# Altium project SOM.PrjPcb (part 1 of 2)
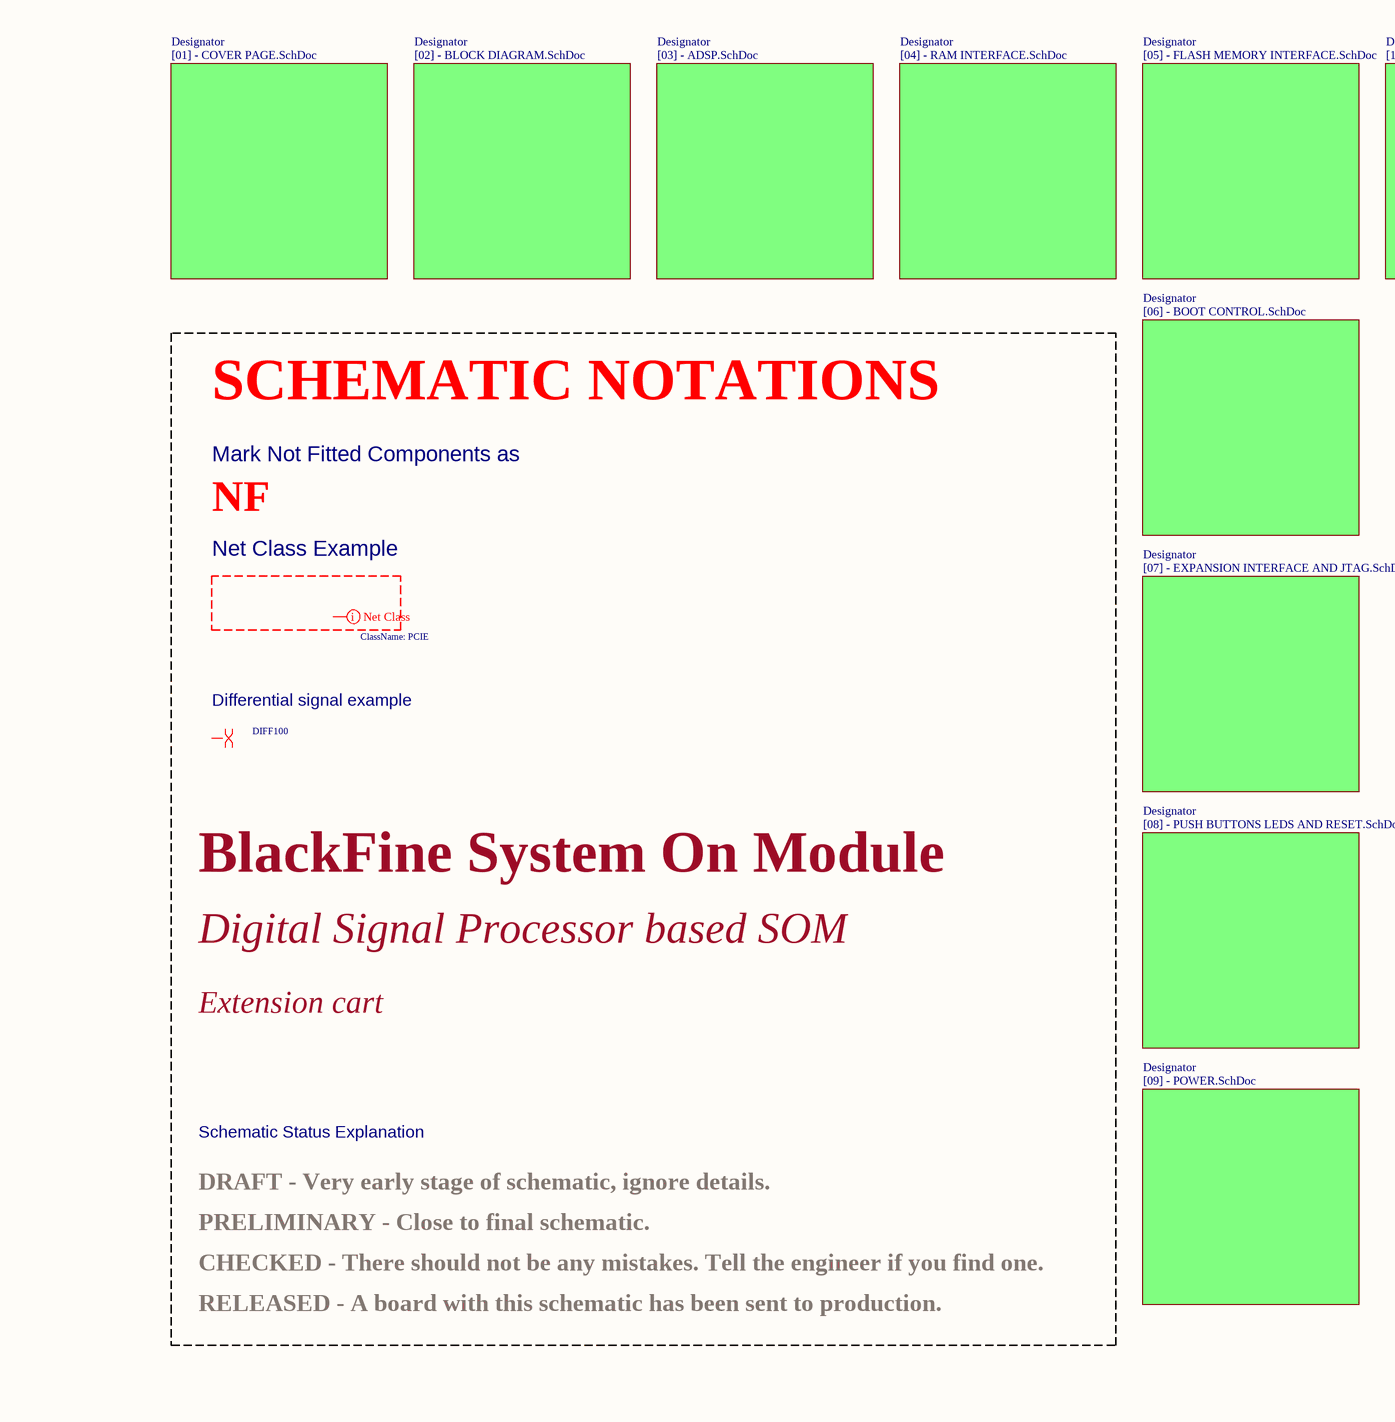
[diagram p0: SystemOnModule.SchDoc, left]
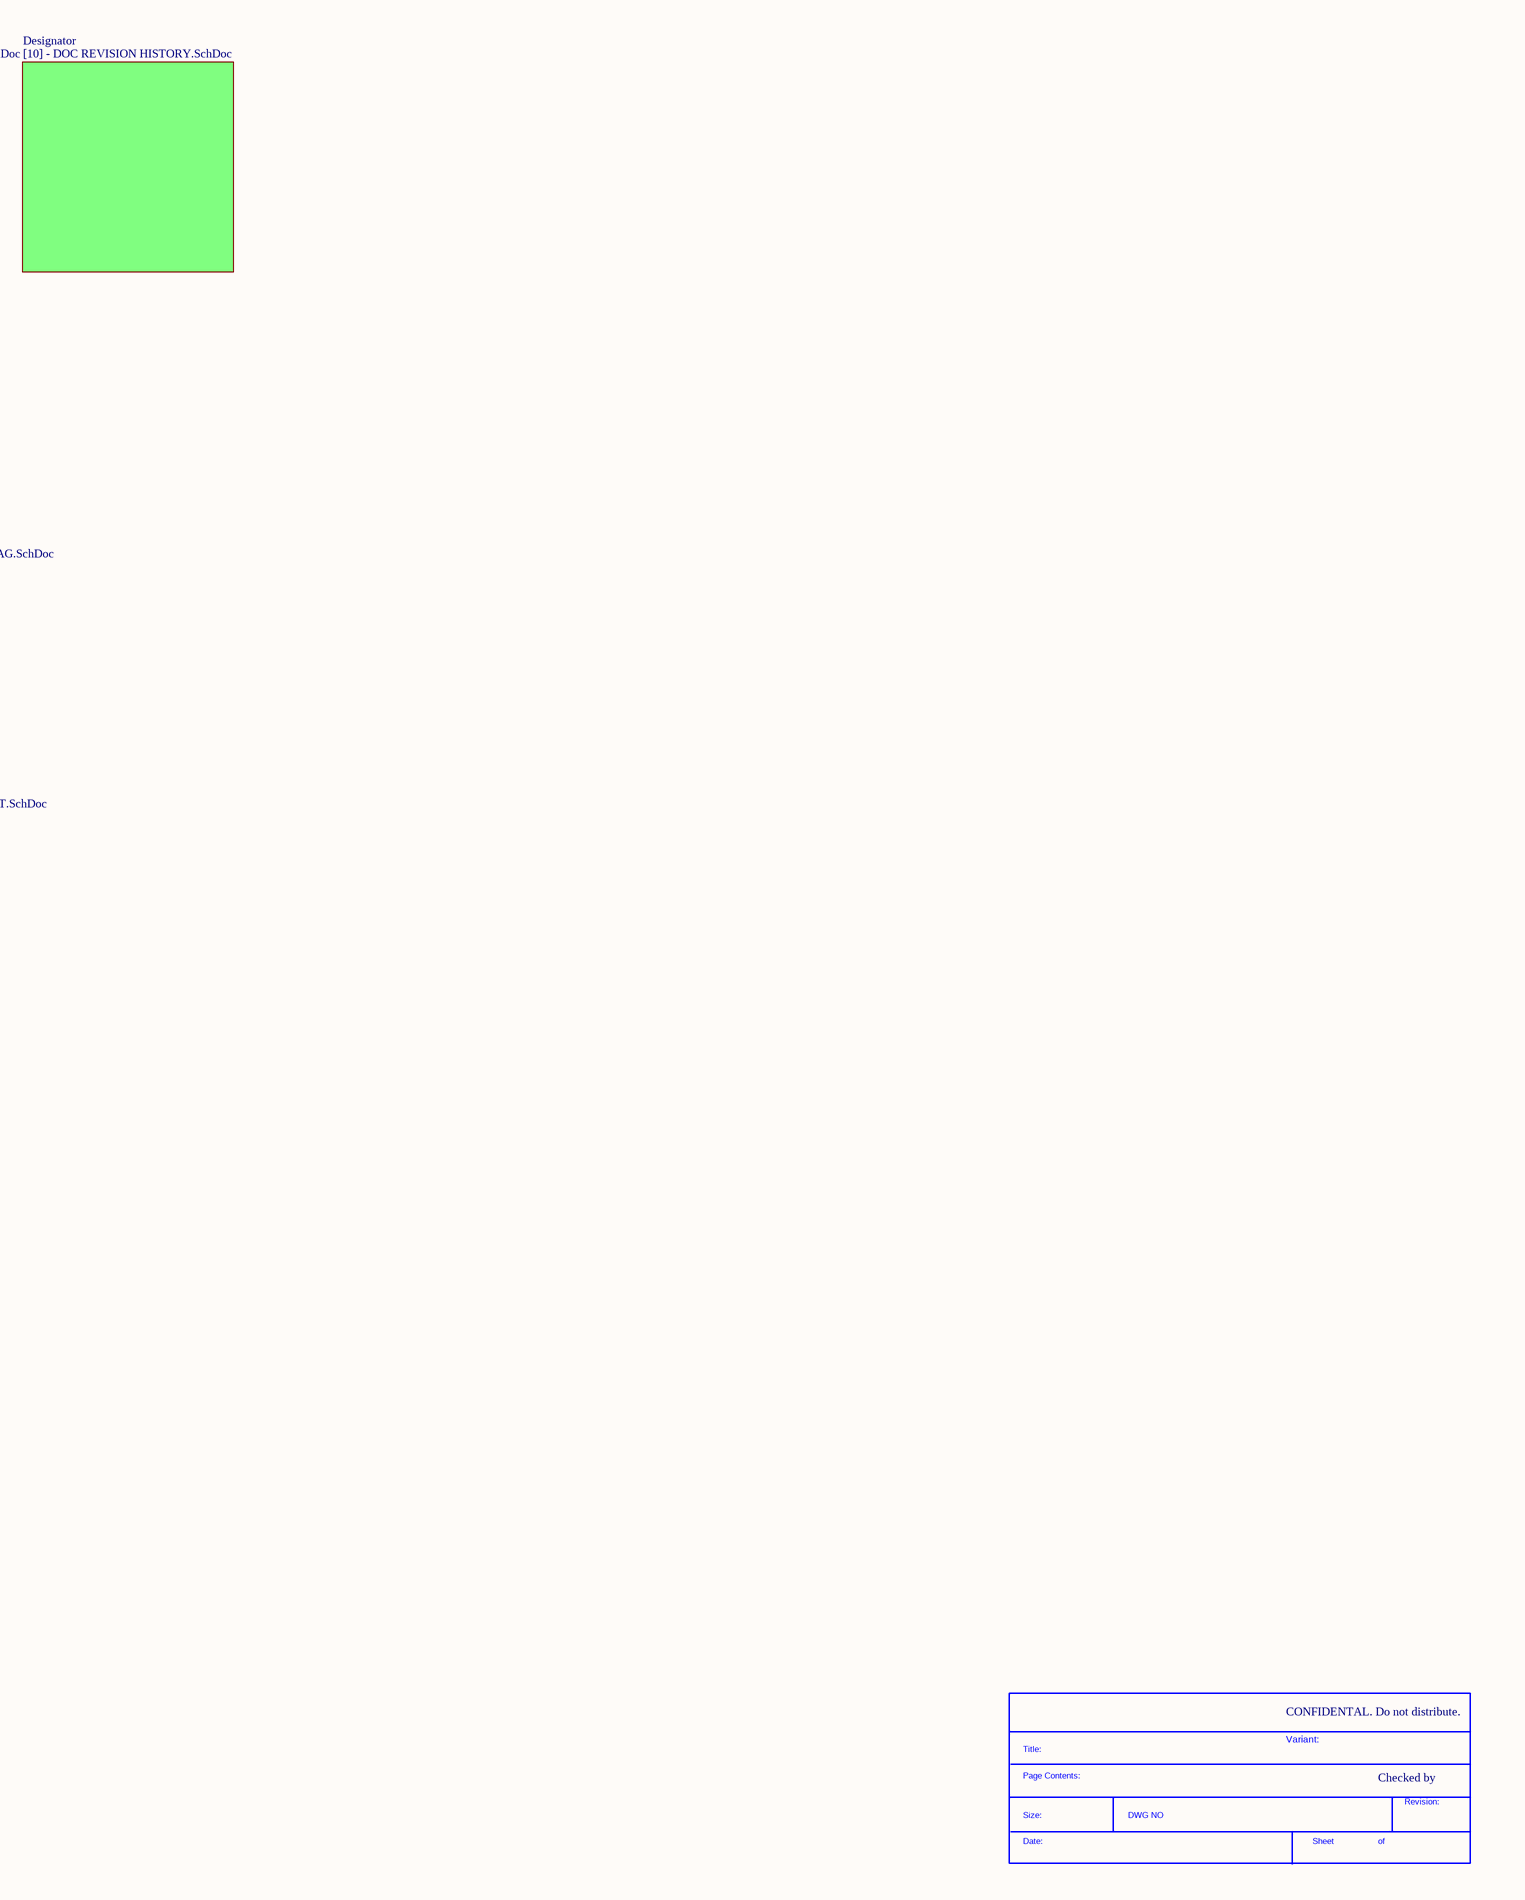
[diagram p1: SystemOnModule.SchDoc, right]
Company: Mars Robotics; Project: Blackfin DSP; SheetTotal: 10; VariantName: ORIGIN; VersionRevision: V1I1
11 sheets, 97 parts. Net scope: flat (ports and power ports of the same name join across sheets).
Board files: SOM_PCB.PcbDoc, SOM_PCB_6Layer.PcbDoc, SOM_PCB_BLUETECHNIX.PcbDoc
Sheets:
  SystemOnModule.SchDoc
    Designator = [01] - COVER PAGE.SchDoc
    Designator = [02] - BLOCK DIAGRAM.SchDoc
    Designator = [06] - BOOT CONTROL.SchDoc
    Designator = [03] - ADSP.SchDoc
    Designator = [04] - RAM INTERFACE.SchDoc
    Designator = [05] - FLASH MEMORY INTERFACE.SchDoc
    Designator = [07] - EXPANSION INTERFACE AND JTAG.SchDoc
    Designator = [08] - PUSH BUTTONS LEDS AND RESET.SchDoc
    Designator = [09] - POWER.SchDoc
    Designator = [10] - DOC REVISION HISTORY.SchDoc

## Sheet SystemOnModule.SchDoc
size A2; CompanyName: KDS; Organization: KDS; DocumentNumber: 4; Revision: V1I1; SheetNumber: 0; SheetTotal: 10; PageSetup: Record=PageOptions|CenterHorizontal=True|CenterVertical=True|PrintScale=1.07|XCorrection=1.00|YCorrection=1.00|PrintKind=1|BorderSize=5000000|LeftOffset=0|BottomOffset=0|Orientation=2|PaperLength=1000|PaperWidth=1000|Scale=100|PaperSource=7|PrintQuality=600|MediaType=1|DitherType=10|PaperKind=A3|PrintScaleMode=1; ProjectName: KDS C6A816x Module

### Parts
(Parts that share a designator on the sheet are numbered #1, #2 ... from top to bottom, then left to right.)
*#1  SDTitleBlock  (value not drawn)  (graphical)

### Sub-sheets
Designator = [01] - COVER PAGE.SchDoc: no entries
Designator = [02] - BLOCK DIAGRAM.SchDoc: no entries
Designator = [06] - BOOT CONTROL.SchDoc: no entries
Designator = [03] - ADSP.SchDoc: no entries
Designator = [04] - RAM INTERFACE.SchDoc: no entries
Designator = [05] - FLASH MEMORY INTERFACE.SchDoc: no entries
Designator = [07] - EXPANSION INTERFACE AND JTAG.SchDoc: no entries
Designator = [08] - PUSH BUTTONS LEDS AND RESET.SchDoc: no entries
Designator = [09] - POWER.SchDoc: no entries
Designator = [10] - DOC REVISION HISTORY.SchDoc: no entries

### Layout directives
net class PCIE: (no net found under the mark)
differential pair; net class DIFF100: (no net found under the mark)

### Notes on the sheet
- SCHEMATIC NOTATIONS
- Mark Not Fitted Components as
- NF
- Net Class Example
- Differential signal example
- BlackFine System On Module
- Digital Signal Processor based SOM
- Extension cart
- Schematic Status Explanation
- PRELIMINARY - Close to final schematic.
- DRAFT - Very early stage of schematic, ignore details.
- CHECKED - There should not be any mistakes. Tell the engineer if you find one.
- RELEASED - A board with this schematic has been sent to production.
- CONFIDENTAL. Do not distribute.
- Variant:
- Checked by
- (in symbol SDTitleBlock) Title:; Page Contents:; Revision:; Size:; DWG NO; Date:; Sheet; of

## Sheet [01] - COVER PAGE.SchDoc
size A2; DocumentNumber: 1; SheetNumber: 1; SheetTotal: 10; VariantName: ORIGIN
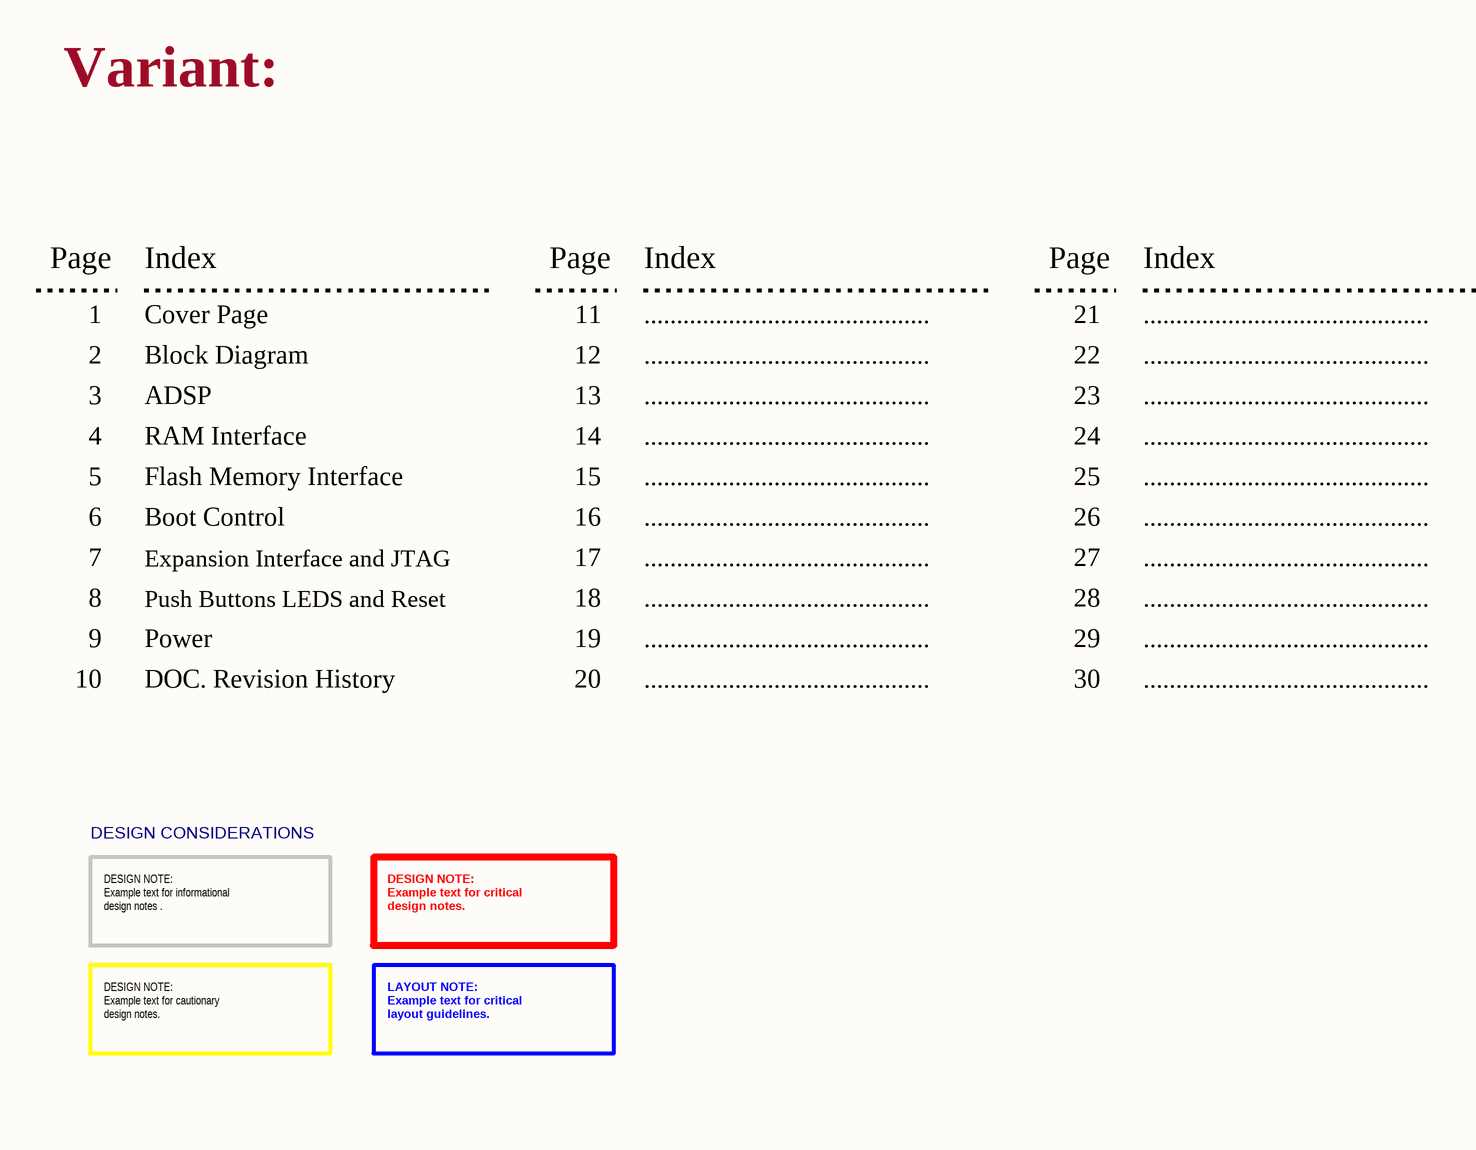
[diagram p2: [01] - COVER PAGE.SchDoc, left]
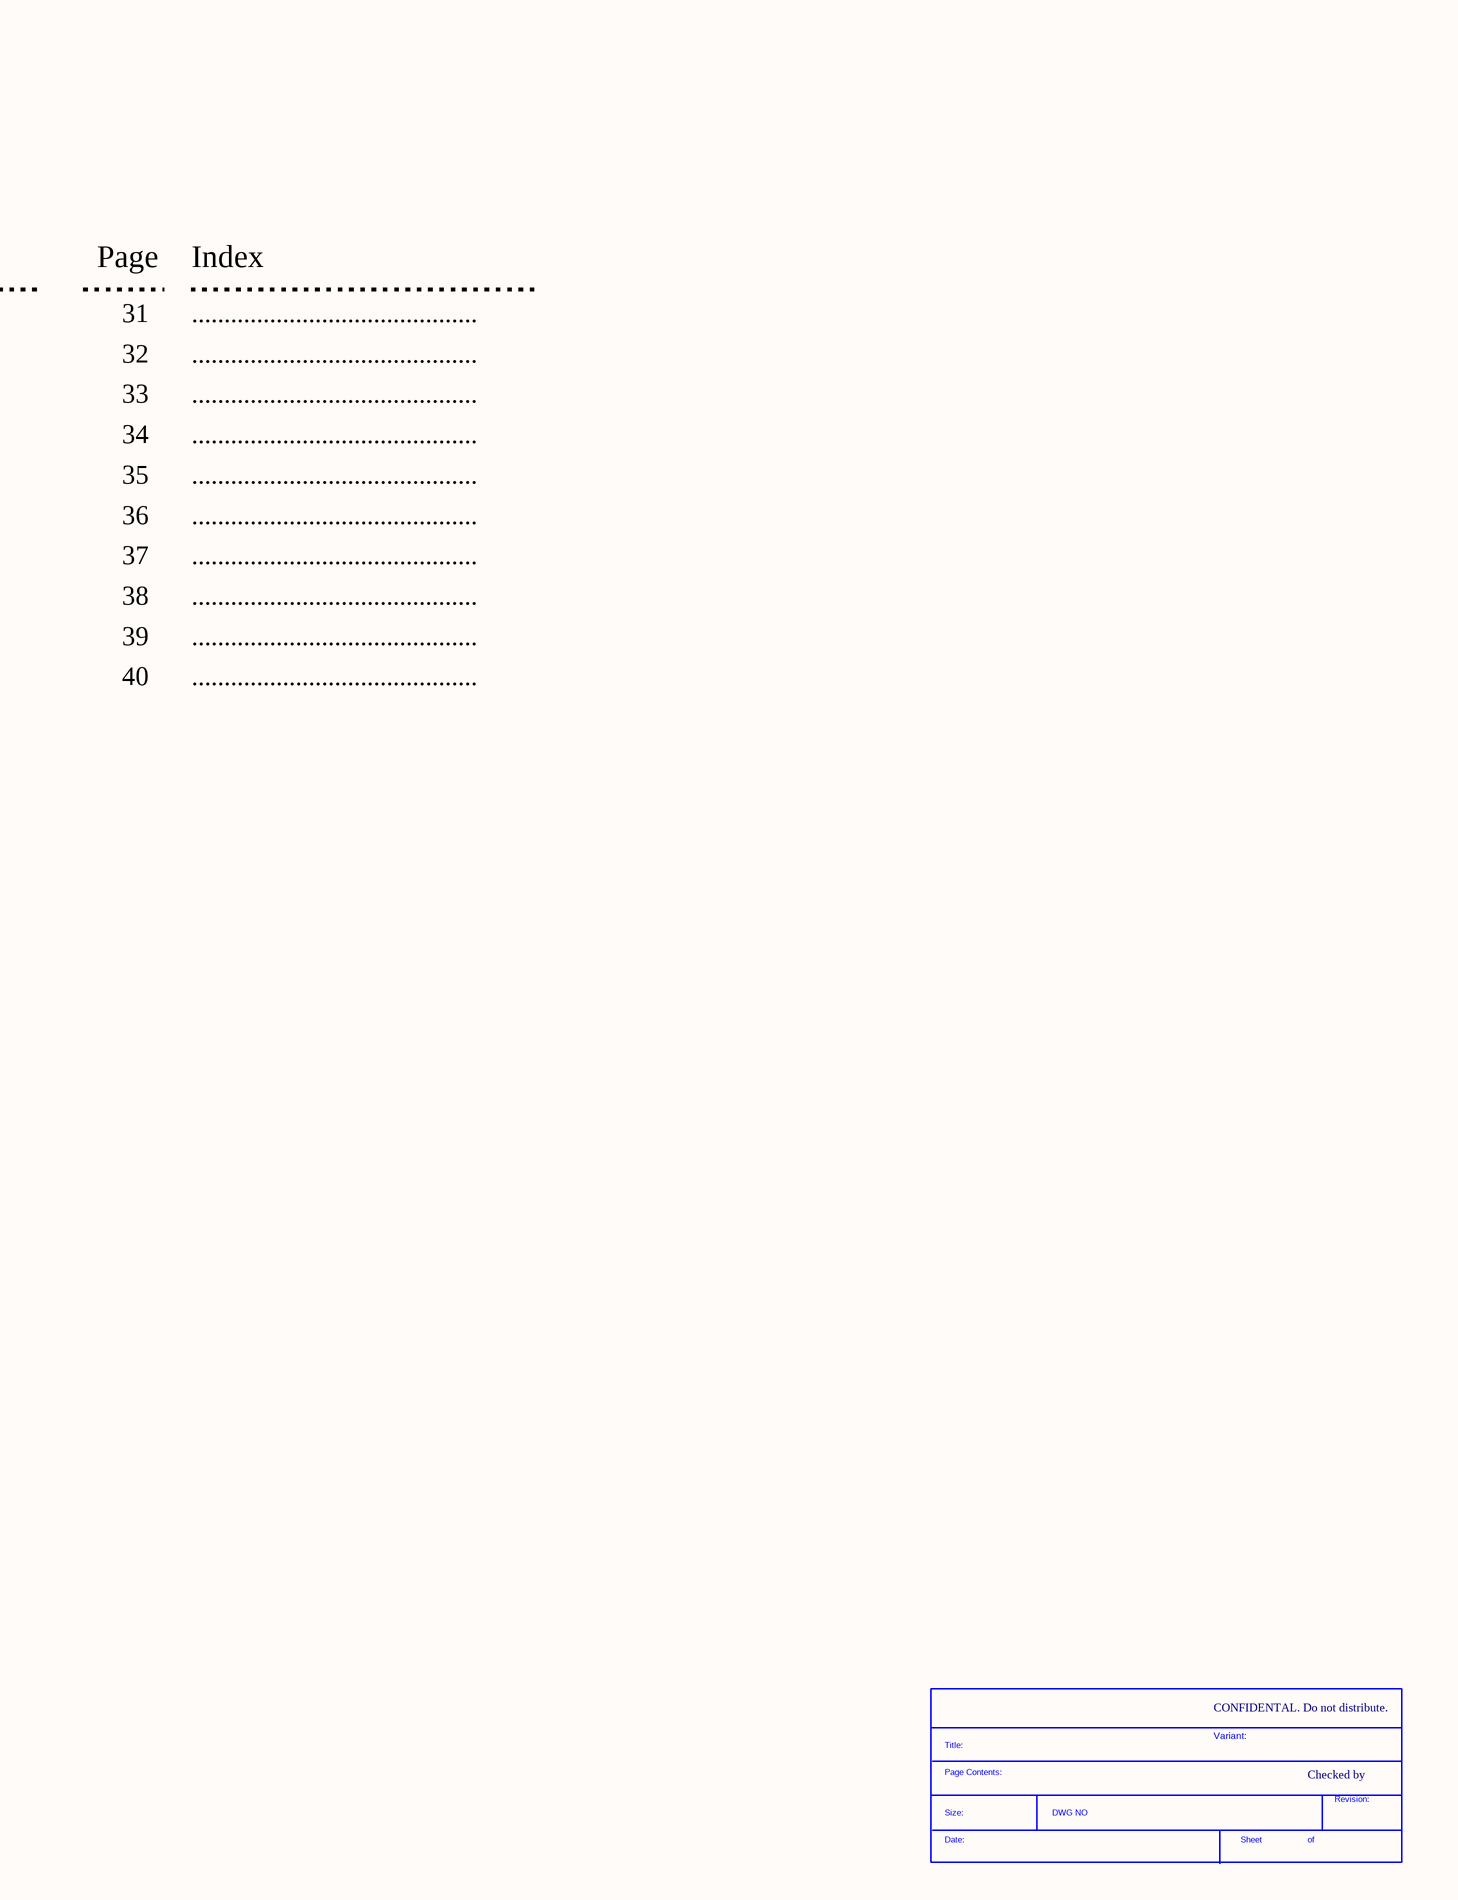
[diagram p3: [01] - COVER PAGE.SchDoc, right]

### Parts
(Parts that share a designator on the sheet are numbered #1, #2 ... from top to bottom, then left to right.)
*#2  SDTitleBlock  (value not drawn)  (graphical)

### Notes on the sheet
- Variant:
- Page
- Index
- 1
- 2
- Cover Page
- Block Diagram
- 11
- 12
- ............................................
- 21
- 22
- 31
- 32
- 3
- 4
- ADSP
- RAM Interface
- 13
- 14
- 23
- 24
- 33
- 34
- 5
- Flash Memory Interface
- 15
- 25
- 35
- 6
- 7
- Boot Control
- Expansion Interface and JTAG
- 16
- 17
- 26
- 27
- 36
- 37
- 8
- 9
- Push Buttons LEDS and Reset
- Power
- 18
- 19
- 28
- 29
- 38
- 39
- 10
- DOC. Revision History
- 20
- 30
- 40
- DESIGN CONSIDERATIONS
- DESIGN NOTE:
  Example text for informational
  design notes .
- DESIGN NOTE:
  Example text for critical
  design notes.
- DESIGN NOTE:
  Example text for cautionary
  design notes.
- LAYOUT NOTE:
  Example text for critical
  layout guidelines.
- CONFIDENTAL. Do not distribute.
- Checked by
- (in symbol SDTitleBlock) Title:; Page Contents:; Revision:; Size:; DWG NO; Date:; Sheet; of

## Sheet [02] - BLOCK DIAGRAM.SchDoc
size A2; DocumentNumber: 2; SheetNumber: 2; SheetTotal: 10
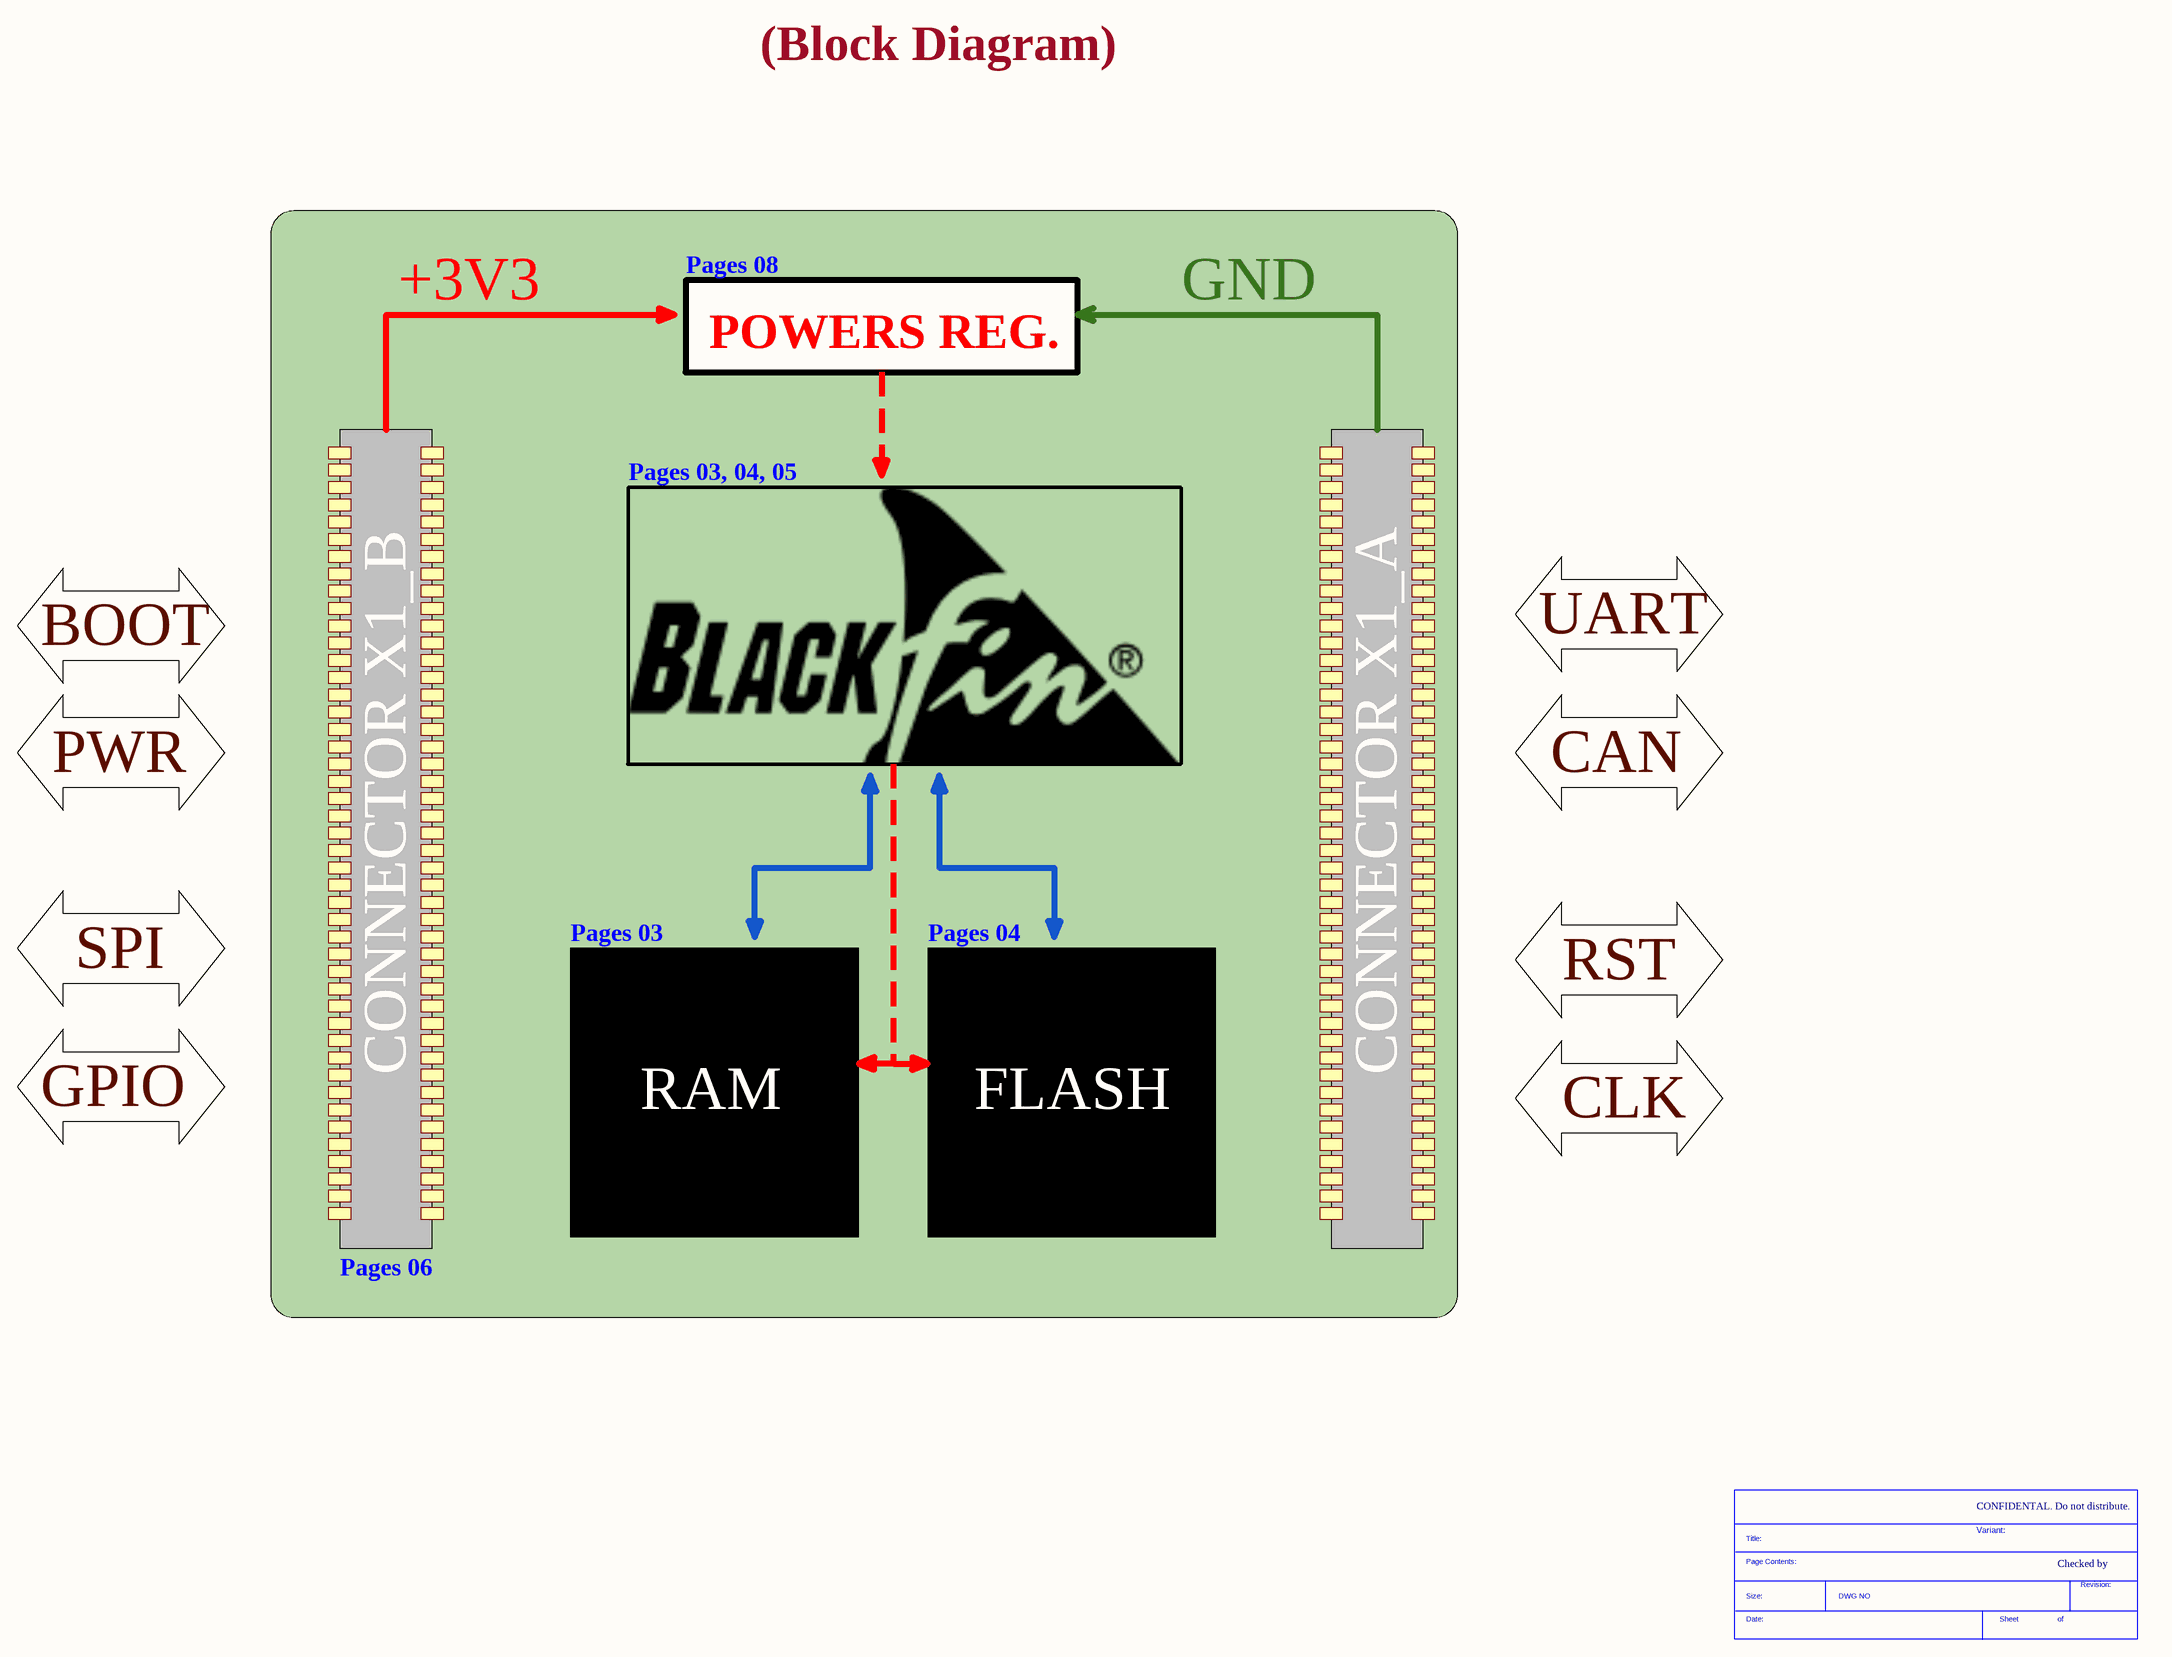
[diagram p4: [02] - BLOCK DIAGRAM.SchDoc]

### Parts
(Parts that share a designator on the sheet are numbered #1, #2 ... from top to bottom, then left to right.)
*#3  SDTitleBlock  (value not drawn)  (graphical)

### Notes on the sheet
- (Block Diagram)
- +3V3
- Pages 08
- GND
- POWERS REG.
- Pages 03, 04, 05
- BOOT
- UART
- PWR
- CAN
- Pages 03
- Pages 04
- SPI
- RST
- GPIO
- CONNECTOR X1_B
- CONNECTOR X1_A
- RAM
- FLASH
- CLK
- Pages 06
- CONFIDENTAL. Do not distribute.
- Variant:
- Checked by
- (in symbol SDTitleBlock) Title:; Page Contents:; Revision:; Size:; DWG NO; Date:; Sheet; of

## Sheet [06] - BOOT CONTROL.SchDoc
size A2; DocumentNumber: 2; SheetNumber: 6; SheetTotal: 10
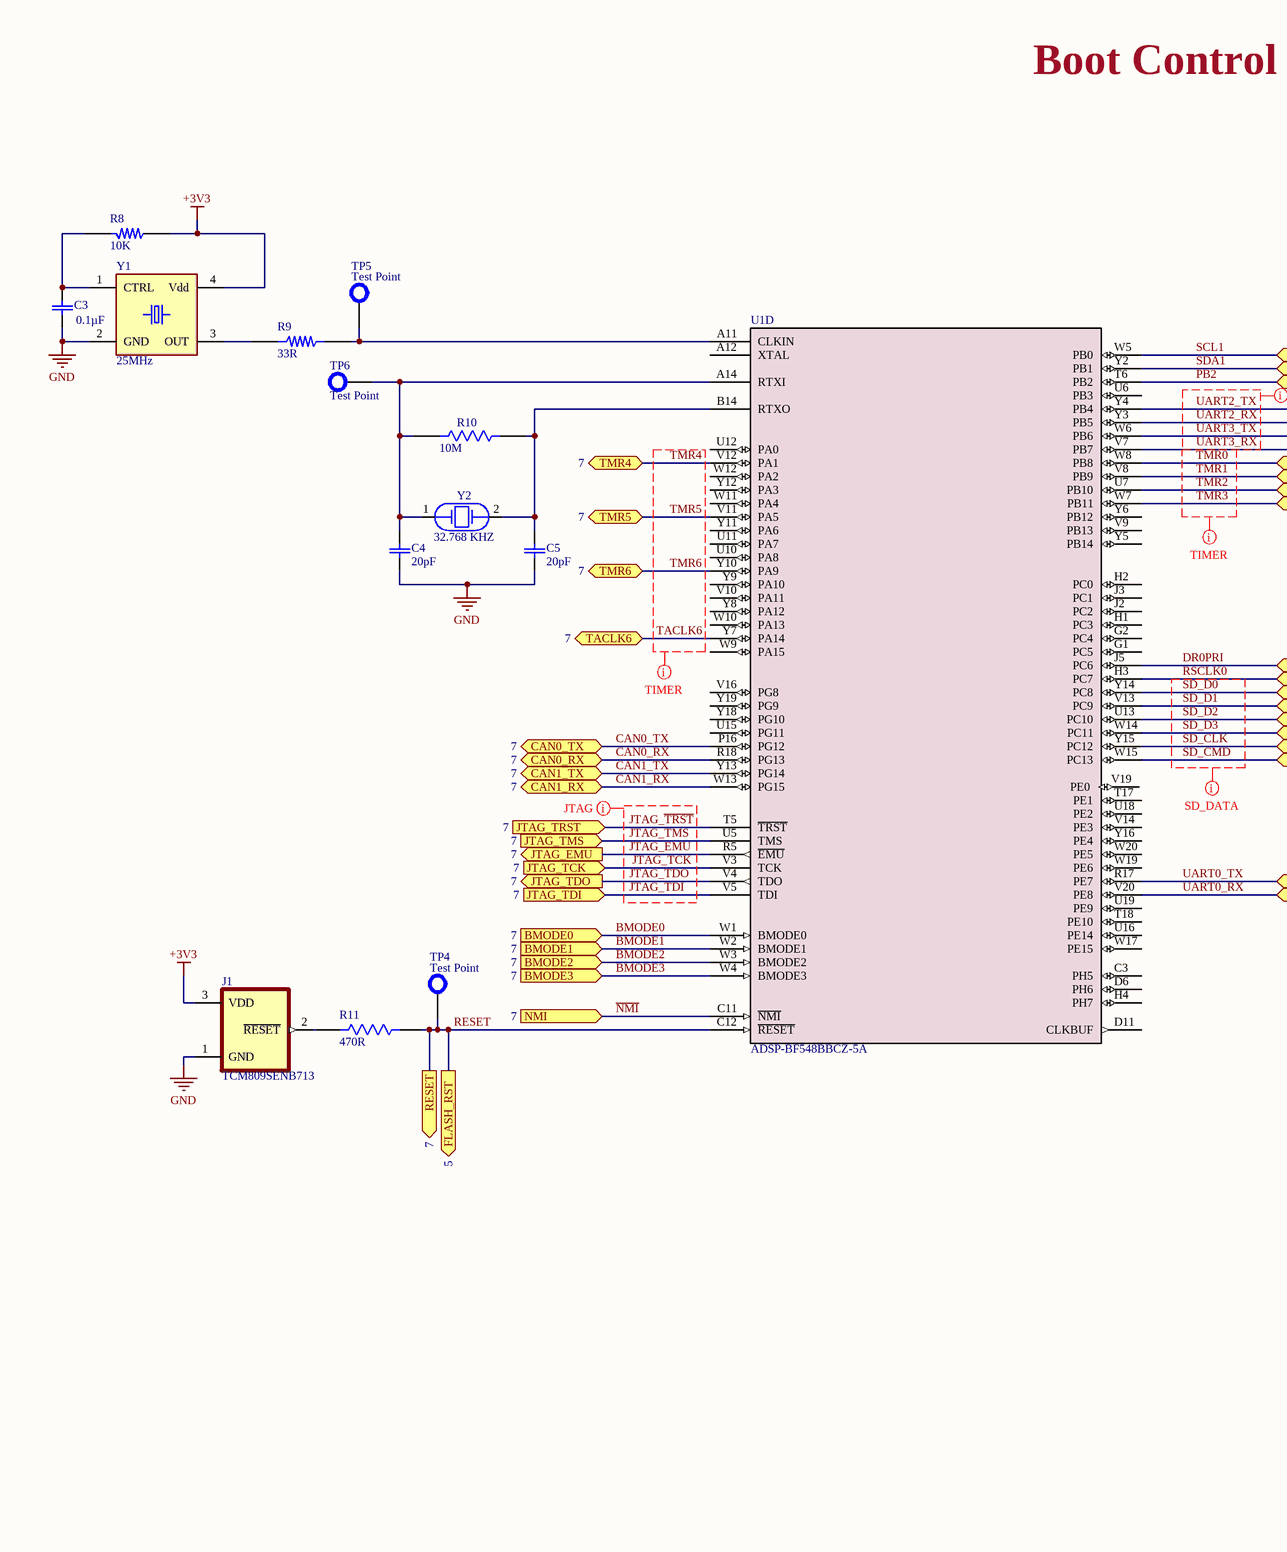
[diagram p5: [06] - BOOT CONTROL.SchDoc, left]
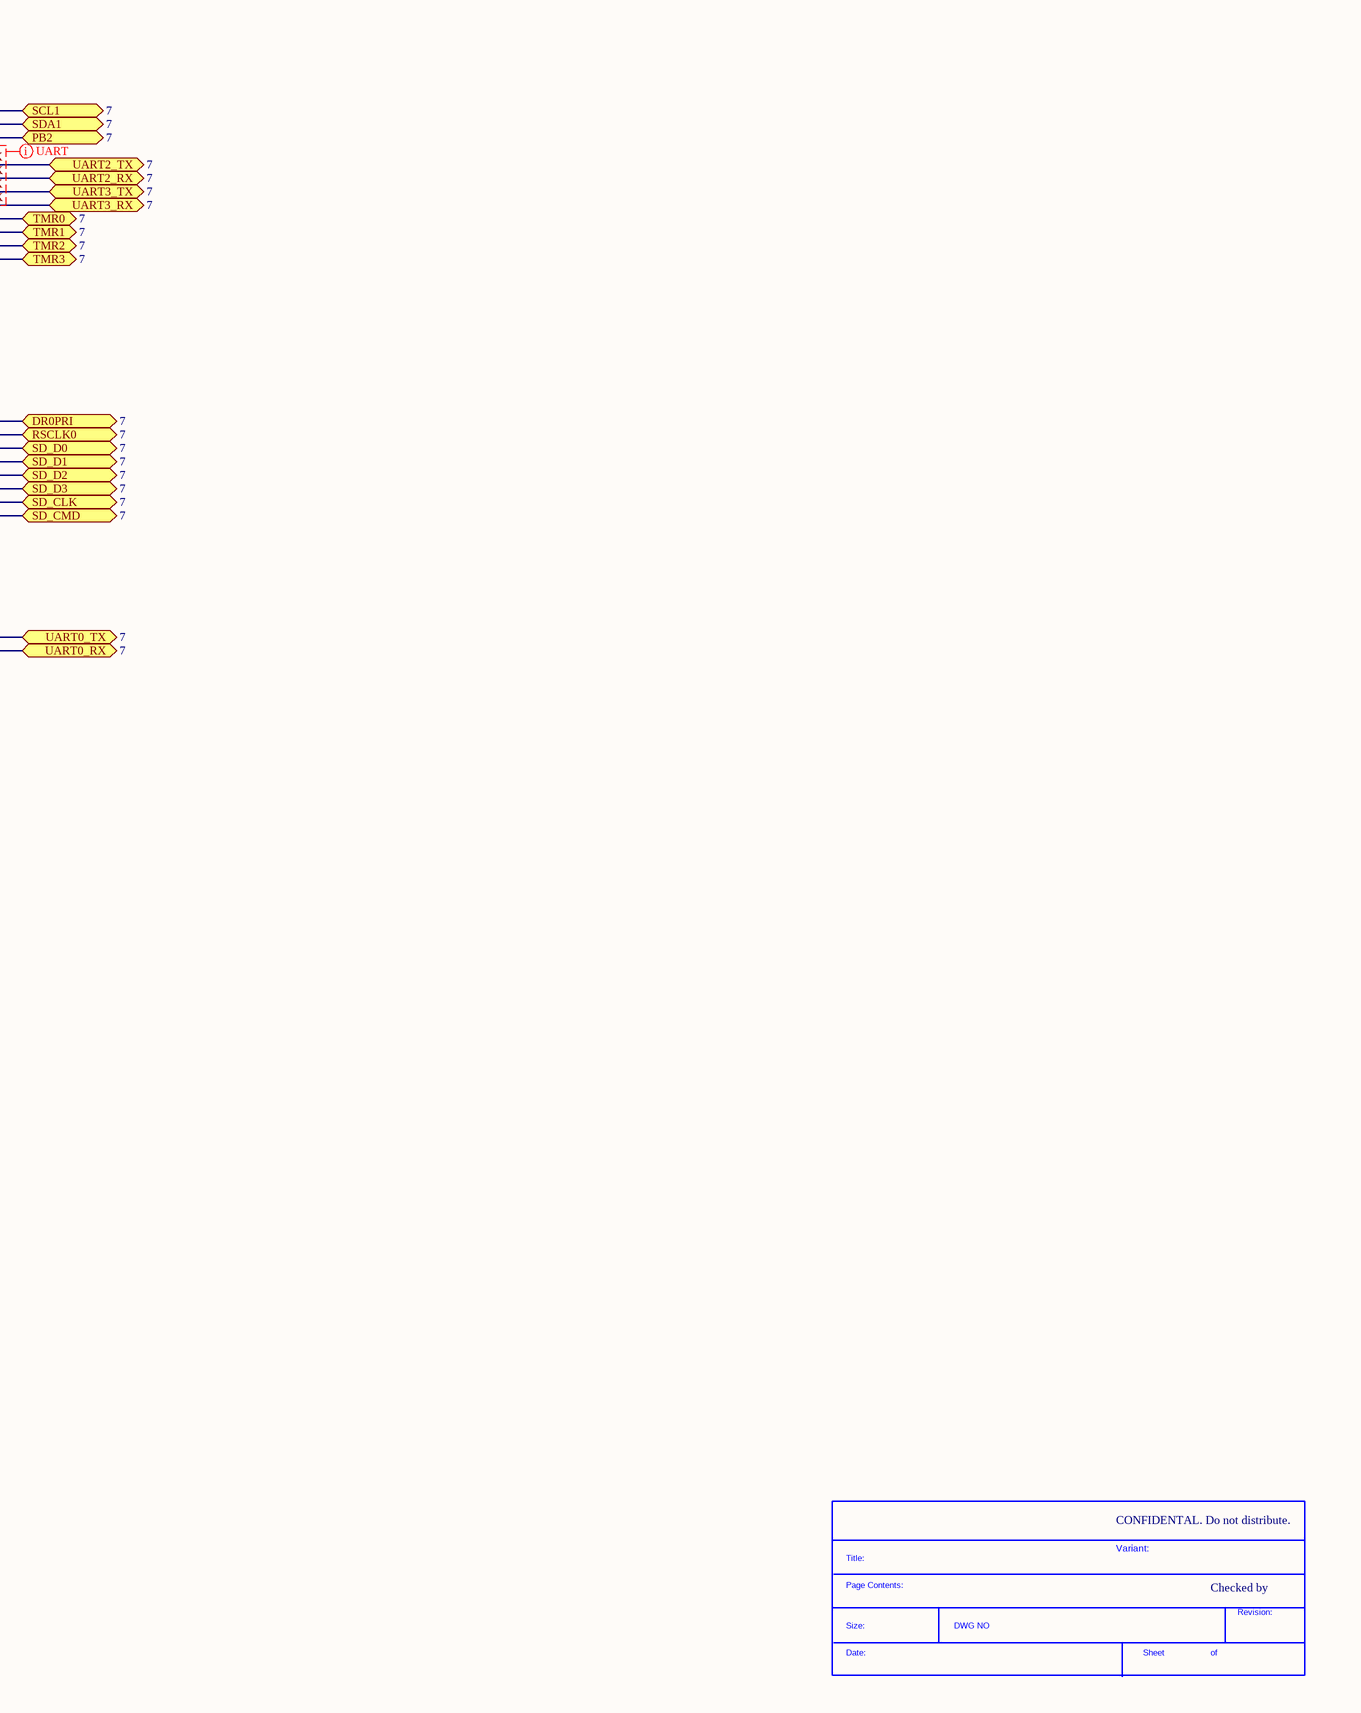
[diagram p6: [06] - BOOT CONTROL.SchDoc, right]

### Parts
(Parts that share a designator on the sheet are numbered #1, #2 ... from top to bottom, then left to right.)
*#4  SDTitleBlock  (value not drawn)  (graphical)
C3  0.1µF  [CAP0402]
C4  20pF  [CAPC10555_55N_KEM-L]
C5  20pF  [CAPC10555_55N_KEM-L]
J1  TCM809SENB713  [SOT-23B]
R8  10K  [RES0402]
R9  33R  [RES0402]
R10  10M  [RES0603]
R11  470R  [RES0402]
TP4  Test Point  [TP_70MIL]
TP5  Test Point  [TP_70MIL]
TP6  Test Point  [TP_70MIL]
U1  ADSP-BF548BBCZ-5A  [BC_400_1_ADI]  (part D of 7)
Y1  25MHz  [4-SMD]
Y2  32.768 KHZ  [XTAL_G83270022]

### Ports
BMODE0 (in, see 7), BMODE1 (in, see 7), BMODE2 (in, see 7), BMODE3 (in, see 7), CAN0_RX (bidir, see 7), CAN0_TX (bidir, see 7), CAN1_RX (bidir, see 7), CAN1_TX (bidir, see 7), DR0PRI (bidir, see 7), FLASH_RST (out, see 5), JTAG_EMU (out, see 7), JTAG_TCK (in, see 7), JTAG_TDI (in, see 7), JTAG_TDO (out, see 7), JTAG_TMS (in, see 7), JTAG_TRST (in, see 7), NMI (in, see 7), PB2 (bidir, see 7), RESET (out, see 7), RSCLK0 (bidir, see 7), SCL1 (bidir, see 7), SD_CLK (bidir, see 7), SD_CMD (bidir, see 7), SD_D0 (bidir, see 7), SD_D1 (bidir, see 7), SD_D2 (bidir, see 7), SD_D3 (bidir, see 7), SDA1 (bidir, see 7), TACLK6 (bidir, see 7), TMR0 (bidir, see 7), TMR1 (bidir, see 7), TMR2 (bidir, see 7), TMR3 (bidir, see 7), TMR4 (bidir, see 7), TMR5 (bidir, see 7), TMR6 (bidir, see 7), UART0_RX (bidir, see 7), UART0_TX (bidir, see 7), UART2_RX (bidir, see 7), UART2_TX (bidir, see 7), UART3_RX (bidir, see 7), UART3_TX (bidir, see 7)

### Nets
+3V3: J1.3(VDD) R8.1 Y1.4(Vdd)
GND: C3.1 C4.1 C5.1 J1.1(GND) Y1.2(GND)
BMODE0: U1.W1(BMODE0) ; port BMODE0
BMODE1: U1.W2(BMODE1) ; port BMODE1
BMODE2: U1.W3(BMODE2) ; port BMODE2
BMODE3: U1.W4(BMODE3) ; port BMODE3
CAN0_RX: U1.R18(PG13) ; port CAN0_RX
CAN0_TX: U1.P16(PG12) ; port CAN0_TX
CAN1_RX: U1.W13(PG15) ; port CAN1_RX
CAN1_TX: U1.Y13(PG14) ; port CAN1_TX
DR0PRI: U1.J5(PC6) ; port DR0PRI
JTAG_~{EMU}: U1.R5(~{EMU}) ; port JTAG_EMU
JTAG_~{TRST}: U1.T5(~{TRST}) ; port JTAG_TRST
JTAG_TCK: U1.V3(TCK) ; port JTAG_TCK
JTAG_TDI: U1.V5(TDI) ; port JTAG_TDI
JTAG_TDO: U1.V4(TDO) ; port JTAG_TDO
JTAG_TMS: U1.U5(TMS) ; port JTAG_TMS
~{NMI}: U1.C11(~{NMI}) ; port NMI
PB2: U1.T6(PB2) ; port PB2
RESET: R11.2 TP4.0 U1.C12(~{RESET}) ; port FLASH_RST, port RESET
RSCLK0: U1.H3(PC7) ; port RSCLK0
SCL1: U1.W5(PB0) ; port SCL1
SD_CLK: U1.Y15(PC12) ; port SD_CLK
SD_CMD: U1.W15(PC13) ; port SD_CMD
SD_D0: U1.Y14(PC8) ; port SD_D0
SD_D1: U1.V13(PC9) ; port SD_D1
SD_D2: U1.U13(PC10) ; port SD_D2
SD_D3: U1.W14(PC11) ; port SD_D3
SDA1: U1.Y2(PB1) ; port SDA1
TACLK6: U1.Y7(PA14) ; port TACLK6
TMR0: U1.W8(PB8) ; port TMR0
TMR1: U1.V8(PB9) ; port TMR1
TMR2: U1.U7(PB10) ; port TMR2
TMR3: U1.W7(PB11) ; port TMR3
TMR4: U1.V12(PA1) ; port TMR4
TMR5: U1.V11(PA5) ; port TMR5
TMR6: U1.Y10(PA9) ; port TMR6
UART0_RX: U1.V20(PE8) ; port UART0_RX
UART0_TX: U1.R17(PE7) ; port UART0_TX
UART2_RX: U1.Y3(PB5) ; port UART2_RX
UART2_TX: U1.Y4(PB4) ; port UART2_TX
UART3_RX: U1.V7(PB7) ; port UART3_RX
UART3_TX: U1.W6(PB6) ; port UART3_TX
NetC3_2: C3.2 R8.2 Y1.1(CTRL)
NetC4_2: C4.2 R10.1 TP6.0 U1.A14(RTXI) Y2.1
NetC5_2: C5.2 R10.2 U1.B14(RTXO) Y2.2
NetJ1_2: J1.2(~{RESET}) R11.1
NetR9_1: R9.1 Y1.3(OUT)
NetR9_2: R9.2 TP5.0 U1.A11(CLKIN)

Not connected (* = marked no-connect by the designer): U1 A12(XTAL) C3(PH5) D6(PH6) D11(CLKBUF) G1(PC5) G2(PC4) H1(PC3) H2(PC0) H4(PH7) J2(PC2) J3(PC1) T17(PE1) T18(PE10) U6(PB3) U10(PA8) U11(PA7) U12(PA0) U15(PG11) U16(PE14) U18(PE2) U19(PE9) V9(PB13) V10(PA11) V14(PE3) V16(PG8) V19(PE0) W9(PA15) W10(PA13) W11(PA4) W12(PA2) W17(PE15) W19(PE6) W20(PE5) Y5(PB14) Y6(PB12) Y8(PA12) Y9(PA10) Y11(PA6) Y12(PA3) Y16(PE4) Y18(PG10) Y19(PG9)

### Layout directives
net class SD_DATA: RSCLK0, SD_CLK, SD_CMD, SD_D0, SD_D1, SD_D2, SD_D3
net class TIMER: TACLK6, TMR0, TMR1, TMR2, TMR3, TMR4, TMR5, TMR6, UART3_RX
net class UART: UART2_RX, UART2_TX, UART3_RX, UART3_TX
net class JTAG: JTAG_TCK, JTAG_TDI, JTAG_TDO, JTAG_TMS, JTAG_~{EMU}, JTAG_~{TRST}

### Notes on the sheet
- Boot Control
- CLOCKS (CPU & PCIE)
- CONFIDENTAL. Do not distribute.
- Variant:
- Checked by
- (in symbol SDTitleBlock) Title:; Page Contents:; Revision:; Size:; DWG NO; Date:; Sheet; of

### Library data of the parts
C3 = CL05B104KO5NNNC: 0.1µF ±10% 16V Ceramic Capacitor X7R 0402 (1005 Metric); Manufacturer: Samsung Electro-Mechanics; Digi-Key Part Number: 1276-1001-2-ND; Manufacturer Product Number: CL05B104KO5NNNC; Capacitance: 0.1µF; Package / Case: 0402 (1005 Metric)
C4 C5 = C0402C200J3GAC7867: 20pF ±5% 25V Ceramic Capacitor C0G, NP0 0402 (1005 Metric); Vendor: Kemet; Manufacturer Part Number: C0402C200J3GAC7867; Tolerance: ±5%; Voltage - Rated: 25V; Temperature Coefficient: C0G, NP0; Operating Temperature: -55°C ~ 125°C; Package: 0402; Capacitance: 20pF
J1 = TCM809SENB713: Supervisor Push-Pull, Totem Pole 1 Channel SOT-23-3; Manufacturer: Microchip Technology; Digi-Key Part Number: TCM809SENB713TR-ND; Manufacturer Product Number: TCM809SENB713; Package / Case: TO-236-3, SC-59, SOT-23-3
R8 = RE0402FRE0710KL: 10 kOhms ±1% 0.063W, 1/16W Chip Resistor 0402 (1005 Metric) Moisture Resistant Thick Film; Manufacturer: Yageo; Digi-Key Part Number: 13-RE0402FRE0710KLTR-ND; Manufacturer Product Number: RE0402FRE0710KL; Supplier: Yageo; Package / Case: 0402 (1005 Metric)
R9 = CRCW040233R0JNEE: 33 Ohms ±5% 0.063W, 1/16W Chip Resistor 0402 (1005 Metric) Automotive AEC-Q200 Thick Film; Manufacturer: Vishay Dale; Digi-Key Part Number: CRCW040233R0JNEE-ND; Manufacturer Product Number: CRCW040233R0JNEE; Supplier: Vishay Dale; Package / Case: 0402; Resistance: 33R
R10 = CRCW060310M0FHEAP: 10 MOhms ±1% 0.1W, 1/10W Chip Resistor 0603 (1608 Metric) Automotive AEC-Q200 Thick Film; Manufacturer: Vishay Dale; Digi-Key Part Number: CRCW060310M0FHEAP-ND; Manufacturer Product Number: CRCW060310M0FHEAP; Package / Case: 0603; Resistance: 10 MOhms
R11 = CRGCQ0402F470K: 470 kOhms ±1% 0.063W, 1/16W Chip Resistor 0402 (1005 Metric) Automotive AEC-Q200, Moisture Resistant Thick Film; Manufacturer: TE Connectivity Passive Product; Digi-Key Part Number: A129659TR-ND; Manufacturer Product Number: CRGCQ0402F470K; Supplier: TE Connectivity Passive Product; Package / Case: 0402 (1005 Metric)
TP4-TP6 = TP
U1 = ADSP-BF548BBCZ-5A: IC DSP 16BIT 533MHZ 400CSBGA; Manufacturer: Analog Devices Inc.; Manufacturer_Part_Number: ADSP-BF548BBCZ-5A; Supplier: Analog Devices Inc.; Manufacturer Product Number: ADSP-BF548BBCZ-5A; TypeDigi-Key Part Number: ADSP-BF548BBCZ-5A-ND
Y1 = CPPT7L-BR-25.0TS: 25MHz XO (Standard) TTL Oscillator 3.3V Enable/Disable 4-SMD, No Lead; Manufacturer: Cardinal Components Inc.; Digi-Key Part Number: CPPT7L-BR-25.0TS-ND; Manufacturer Product Number: CPPT7L-BR-25.0TS; Supplier: Cardinal Components Inc.; Frequency: 25MHz; Package / Case: 4-SMD, No Lead
Y2 = G83270022: 32.768kHz ±10ppm Crystal 12.5pF 70 kOhms 2-SMD, No Lead; MF: Diodes Inc.; Value: 32.768kHz; Package: 2-SMD, No Lead; Load Capacitance: 12.5pF; Manufacturer Product Number: G83270022; Frequency Tolerance: ±10ppm

## Sheet [03] - ADSP.SchDoc
size A2; DocumentNumber: 2; SheetNumber: 3; SheetTotal: 10
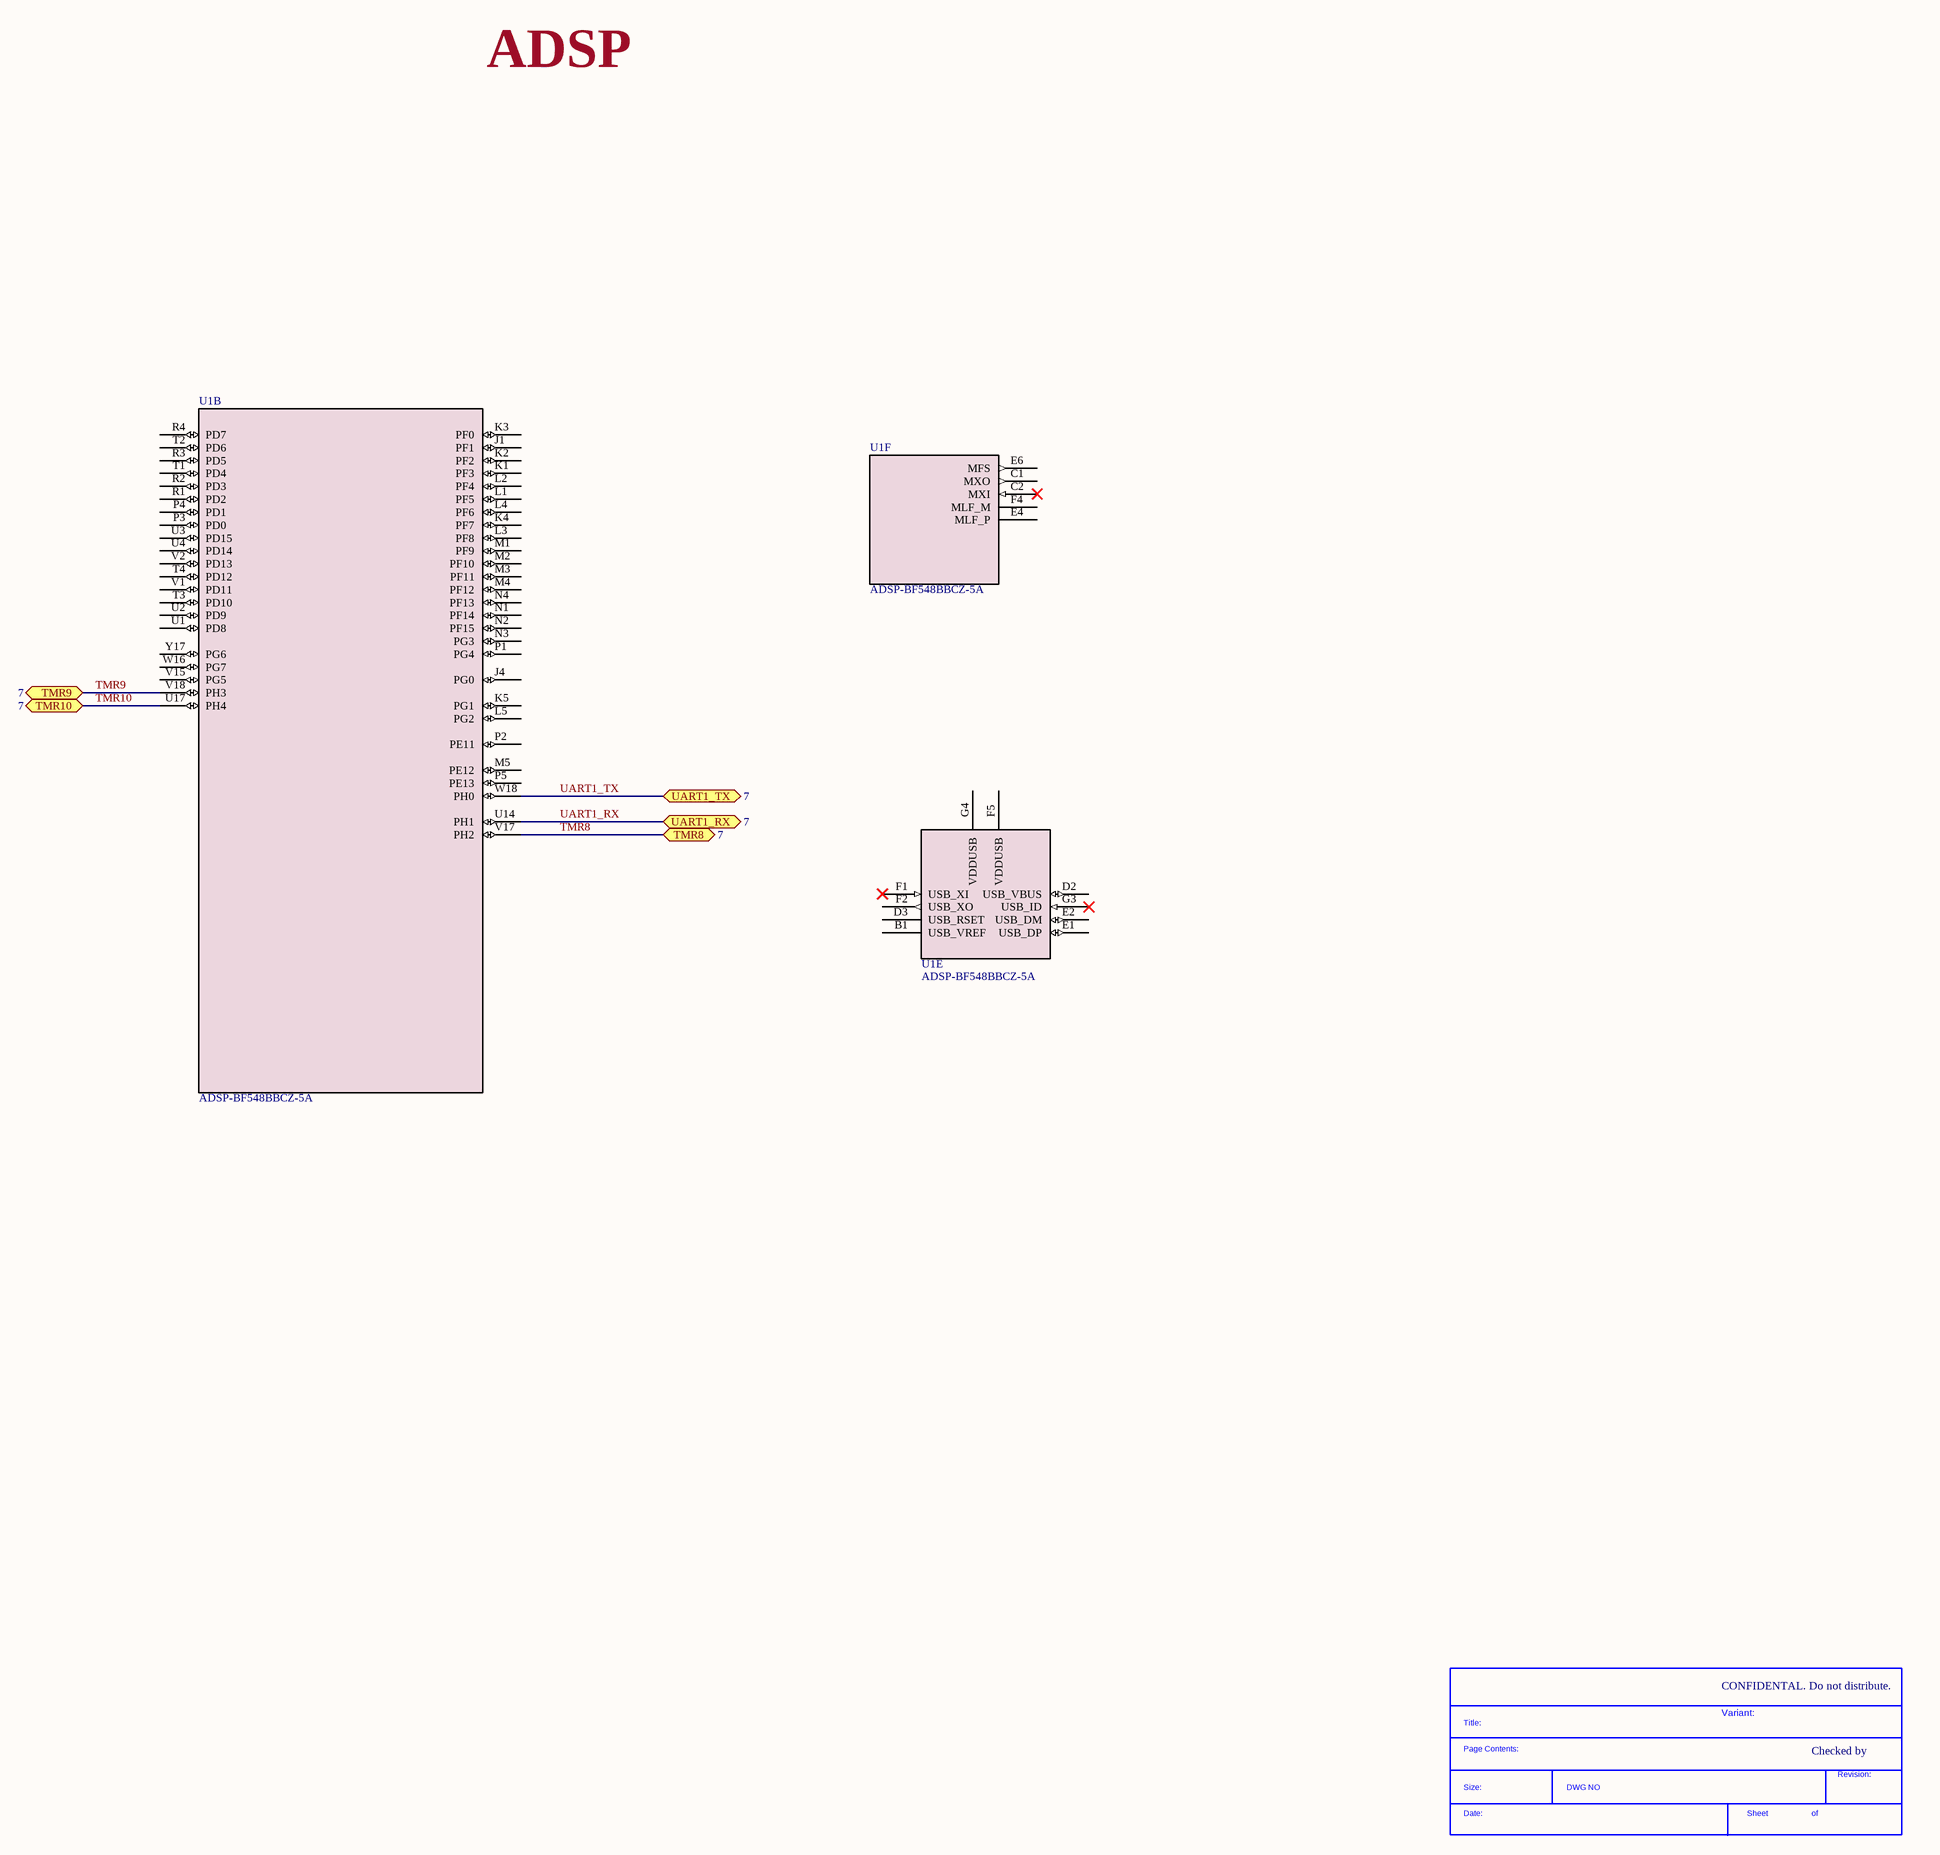
[diagram p7: [03] - ADSP.SchDoc]

### Parts
(Parts that share a designator on the sheet are numbered #1, #2 ... from top to bottom, then left to right.)
*#5  SDTitleBlock  (value not drawn)  (graphical)
U1  ADSP-BF548BBCZ-5A  [BC_400_1_ADI]  (parts B,E,F of 7)

### Ports
TMR8 (bidir, see 7), TMR9 (bidir, see 7), TMR10 (bidir, see 7), UART1_RX (bidir, see 7), UART1_TX (bidir, see 7)

### Nets
TMR8: U1.V17(PH2) ; port TMR8
TMR9: U1.V18(PH3) ; port TMR9
TMR10: U1.U17(PH4) ; port TMR10
UART1_RX: U1.U14(PH1) ; port UART1_RX
UART1_TX: U1.W18(PH0) ; port UART1_TX

Not connected (* = marked no-connect by the designer): U1 B1(USB_VREF) C1(MXO) C2(MXI)* D2(USB_VBUS) D3(USB_RSET) E1(USB_DP) E2(USB_DM) E4(MLF_P) E6(MFS) F1(USB_XI)* F2(USB_XO) F4(MLF_M) F5(VDDUSB) G3(USB_ID)* G4(VDDUSB) J1(PF1) J4(PG0) K1(PF3) K2(PF2) K3(PF0) K4(PF7) K5(PG1) L1(PF5) L2(PF4) L3(PF8) L4(PF6) L5(PG2) M1(PF9) M2(PF10) M3(PF11) M4(PF12) M5(PE12) N1(PF14) N2(PF15) N3(PG3) N4(PF13) P1(PG4) P2(PE11) P3(PD0) P4(PD1) P5(PE13) R1(PD2) R2(PD3) R3(PD5) R4(PD7) T1(PD4) T2(PD6) T3(PD10) T4(PD12) U1(PD8) U2(PD9) U3(PD15) U4(PD14) V1(PD11) V2(PD13) V15(PG5) W16(PG7) Y17(PG6)

### Notes on the sheet
- ADSP
- CONFIDENTAL. Do not distribute.
- Variant:
- Checked by
- (in symbol SDTitleBlock) Title:; Page Contents:; Revision:; Size:; DWG NO; Date:; Sheet; of

### Library data of the parts
U1 = ADSP-BF548BBCZ-5A: as U1 on sheet [06] - BOOT CONTROL; Manufacturer_Part_Number: ADSP-BF548BBCZ-5A; Supplier: Analog Devices Inc.; Manufacturer Product Number: ADSP-BF548BBCZ-5A; TypeDigi-Key Part Number: ADSP-BF548BBCZ-5A-ND

## Sheet [04] - RAM INTERFACE.SchDoc
size A2; DocumentNumber: 2; SheetNumber: 4; SheetTotal: 10
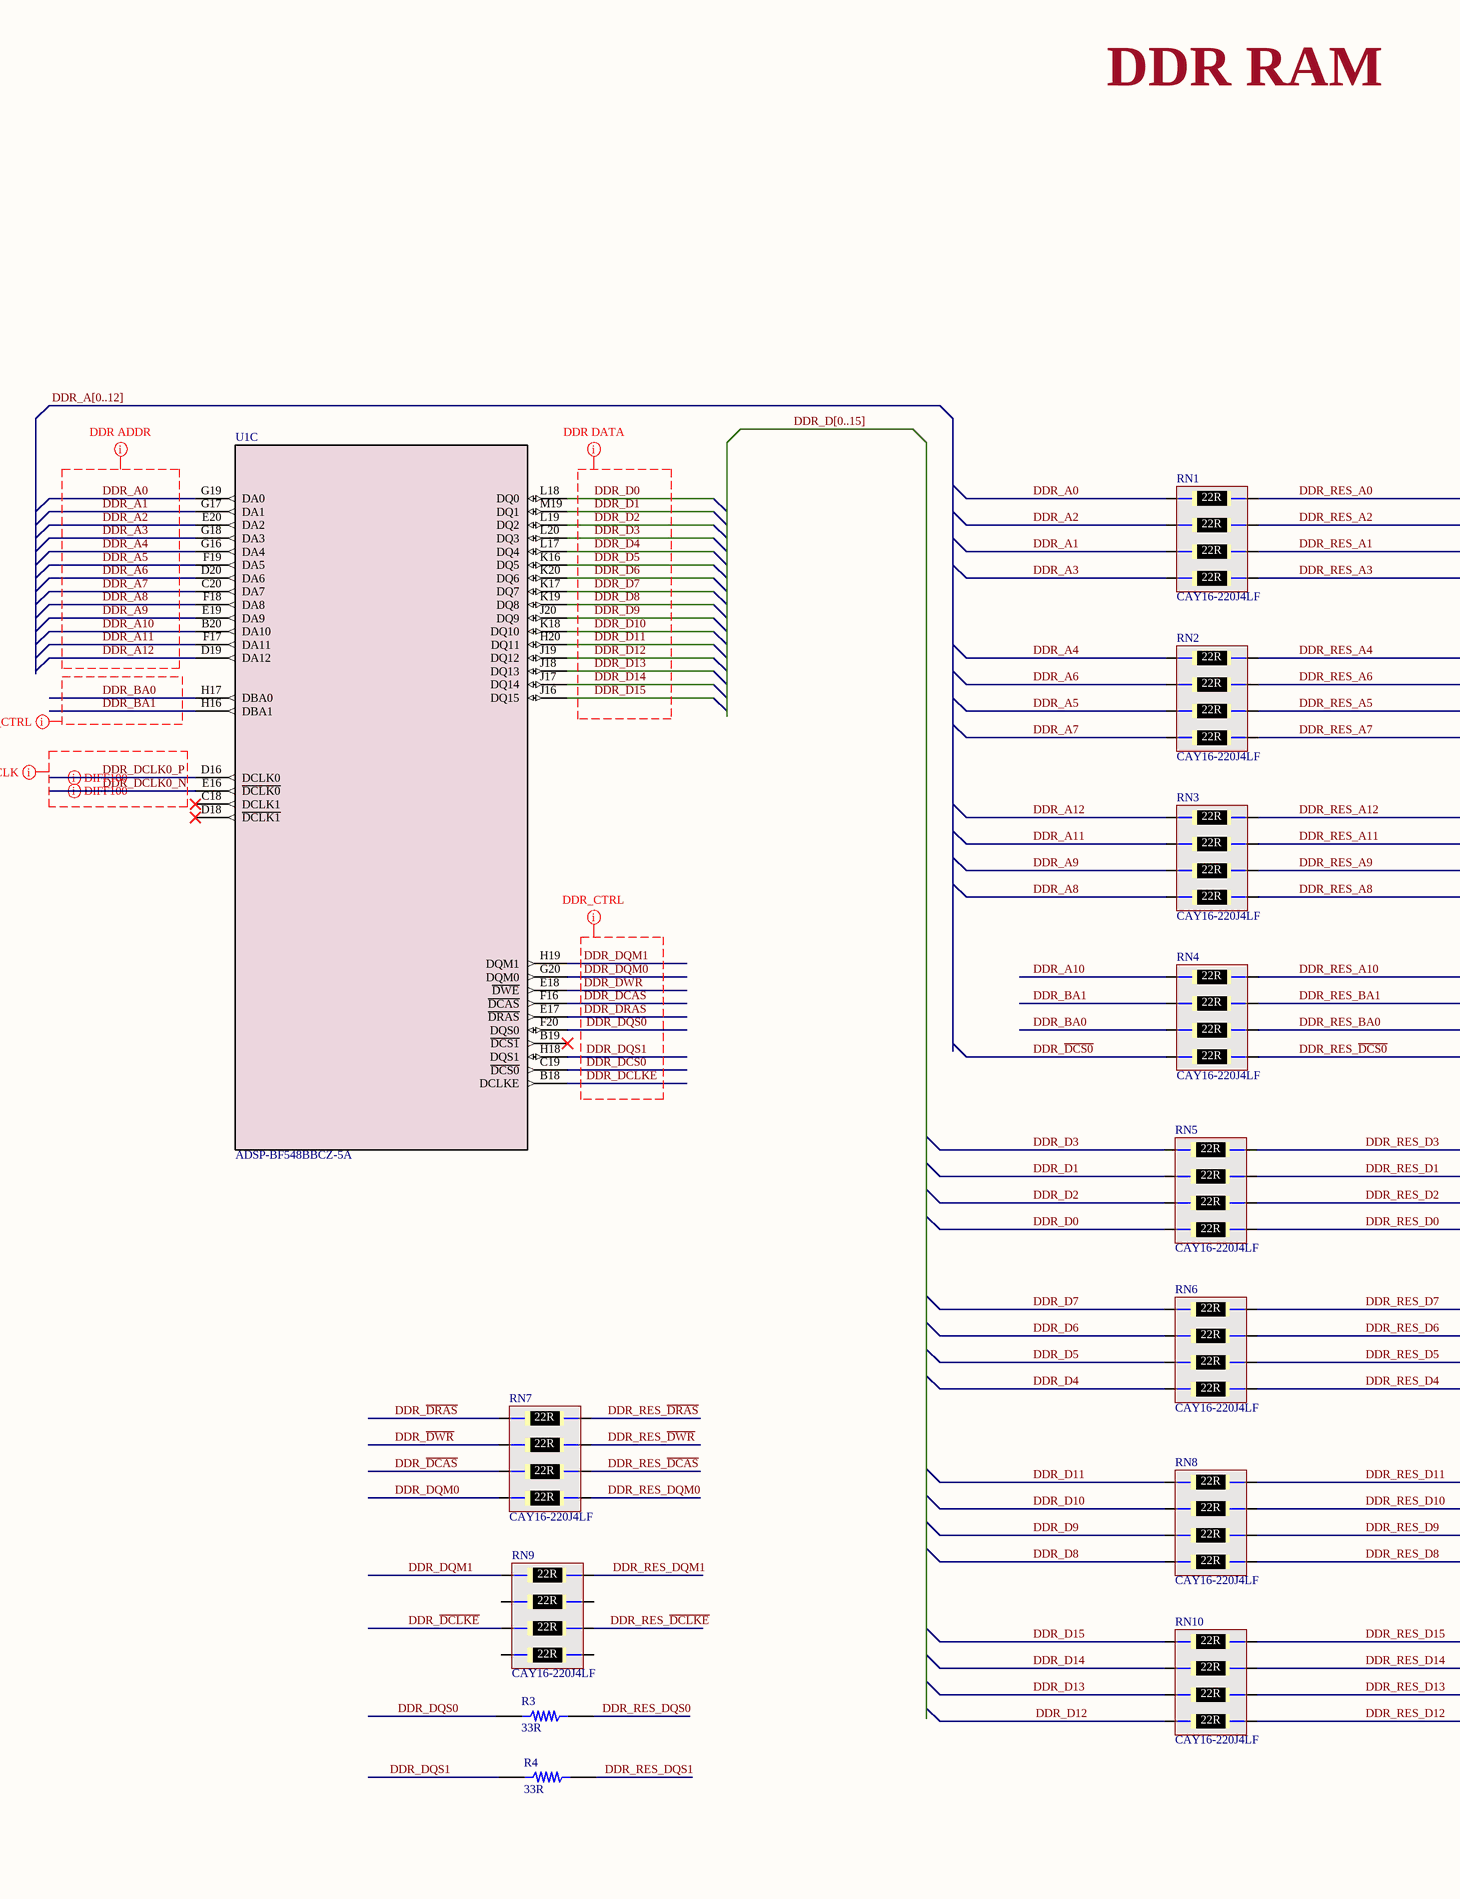
[diagram p8: [04] - RAM INTERFACE.SchDoc, left]
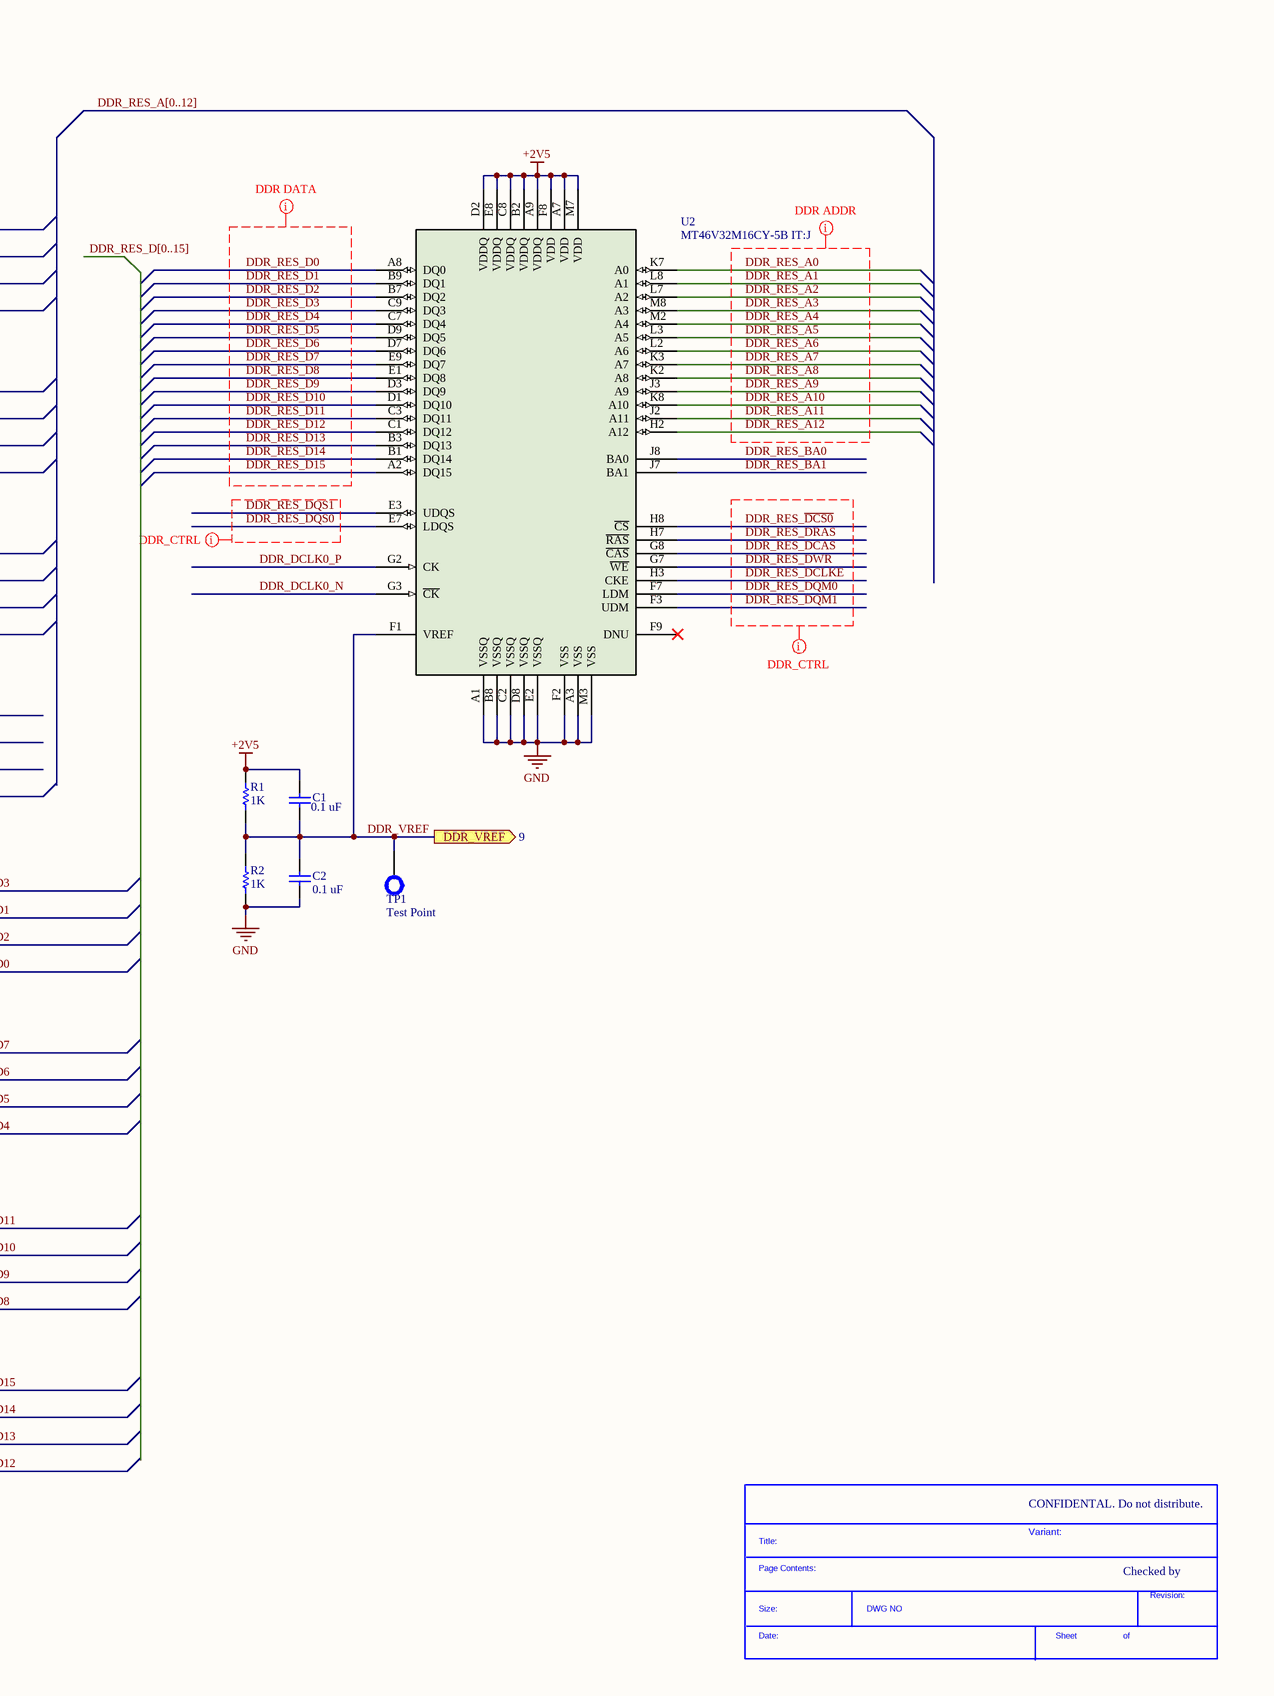
[diagram p9: [04] - RAM INTERFACE.SchDoc, right]

### Parts
(Parts that share a designator on the sheet are numbered #1, #2 ... from top to bottom, then left to right.)
*#6  SDTitleBlock  (value not drawn)  (graphical)
C1  0.1 uF  [CAP0402]
C2  0.1 uF  [CAP0402]
R1  1K  [RES0402]
R2  1K  [RES0402]
R3  33R  [RES0402]
R4  33R  [RES0402]
RN1  CAY16-220J4LF  [BO_CAY16]
RN2  CAY16-220J4LF  [BO_CAY16]
RN3  CAY16-220J4LF  [BO_CAY16]
RN4  CAY16-220J4LF  [BO_CAY16]
RN5  CAY16-220J4LF  [BO_CAY16]
RN6  CAY16-220J4LF  [BO_CAY16]
RN7  CAY16-220J4LF  [BO_CAY16]
RN8  CAY16-220J4LF  [BO_CAY16]
RN9  CAY16-220J4LF  [BO_CAY16]
RN10  CAY16-220J4LF  [BO_CAY16]
TP1  Test Point  [TP_70MIL]
U1  ADSP-BF548BBCZ-5A  [BC_400_1_ADI]  (part C of 7)
U2  MT46V32M16CY-5B IT:J  [FBGA60_10X12P5_MRN]

### Ports
DDR_VREF (out, see 9)

### Nets
+2V5: C1.2 R1.2 U2.A7(VDD) U2.A9(VDDQ) U2.B2(VDDQ) U2.C8(VDDQ) U2.D2(VDDQ) U2.E8(VDDQ) U2.F8(VDD) U2.M7(VDD)
GND: C2.1 R2.1 U2.A1(VSSQ) U2.A3(VSS) U2.B8(VSSQ) U2.C2(VSSQ) U2.D8(VSSQ) U2.E2(VSSQ) U2.F2(VSS) U2.M3(VSS)
DDR_A0: RN1.1 U1.G19(DA0)
DDR_A1: RN1.3 U1.G17(DA1)
DDR_A2: RN1.2 U1.E20(DA2)
DDR_A3: RN1.4 U1.G18(DA3)
DDR_A4: RN2.1 U1.G16(DA4)
DDR_A5: RN2.3 U1.F19(DA5)
DDR_A6: RN2.2 U1.D20(DA6)
DDR_A7: RN2.4 U1.C20(DA7)
DDR_A8: RN3.4 U1.F18(DA8)
DDR_A9: RN3.3 U1.E19(DA9)
DDR_A10: RN4.1 U1.B20(DA10)
DDR_A11: RN3.2 U1.F17(DA11)
DDR_A12: RN3.1 U1.D19(DA12)
DDR_BA0: RN4.3 U1.H17(DBA0)
DDR_BA1: RN4.2 U1.H16(DBA1)
DDR_D0: RN5.4 U1.L18(DQ0)
DDR_D1: RN5.2 U1.M19(DQ1)
DDR_D2: RN5.3 U1.L19(DQ2)
DDR_D3: RN5.1 U1.L20(DQ3)
DDR_D4: RN6.4 U1.L17(DQ4)
DDR_D5: RN6.3 U1.K16(DQ5)
DDR_D6: RN6.2 U1.K20(DQ6)
DDR_D7: RN6.1 U1.K17(DQ7)
DDR_D8: RN8.4 U1.K19(DQ8)
DDR_D9: RN8.3 U1.J20(DQ9)
DDR_D10: RN8.2 U1.K18(DQ10)
DDR_D11: RN8.1 U1.H20(DQ11)
DDR_D12: RN10.4 U1.J19(DQ12)
DDR_D13: RN10.3 U1.J18(DQ13)
DDR_D14: RN10.2 U1.J17(DQ14)
DDR_D15: RN10.1 U1.J16(DQ15)
DDR_~{DCAS}: RN7.3 U1.F16(~{DCAS})
DDR_~{DCLKE}: RN9.3 U1.B18(DCLKE)
DDR_~{DCS0}: RN4.4 U1.C19(~{DCS0})
DDR_~{DRAS}: RN7.1 U1.E17(~{DRAS})
DDR_~{DWR}: RN7.2 U1.E18(~{DWE})
DDR_DCLK0_N: U1.E16(~{DCLK0}) U2.G3(~{CK})
DDR_DCLK0_P: U1.D16(DCLK0) U2.G2(CK)
DDR_DQM0: RN7.4 U1.G20(DQM0)
DDR_DQM1: RN9.1 U1.H19(DQM1)
DDR_DQS0: R3.1 U1.F20(DQS0)
DDR_DQS1: R4.1 U1.H18(DQS1)
DDR_RES_A0: RN1.8 U2.K7(A0)
DDR_RES_A1: RN1.6 U2.L8(A1)
DDR_RES_A2: RN1.7 U2.L7(A2)
DDR_RES_A3: RN1.5 U2.M8(A3)
DDR_RES_A4: RN2.8 U2.M2(A4)
DDR_RES_A5: RN2.6 U2.L3(A5)
DDR_RES_A6: RN2.7 U2.L2(A6)
DDR_RES_A7: RN2.5 U2.K3(A7)
DDR_RES_A8: RN3.5 U2.K2(A8)
DDR_RES_A9: RN3.6 U2.J3(A9)
DDR_RES_A10: RN4.8 U2.K8(A10)
DDR_RES_A11: RN3.7 U2.J2(A11)
DDR_RES_A12: RN3.8 U2.H2(A12)
DDR_RES_BA0: RN4.6 U2.J8(BA0)
DDR_RES_BA1: RN4.7 U2.J7(BA1)
DDR_RES_D0: RN5.5 U2.A8(DQ0)
DDR_RES_D1: RN5.7 U2.B9(DQ1)
DDR_RES_D2: RN5.6 U2.B7(DQ2)
DDR_RES_D3: RN5.8 U2.C9(DQ3)
DDR_RES_D4: RN6.5 U2.C7(DQ4)
DDR_RES_D5: RN6.6 U2.D9(DQ5)
DDR_RES_D6: RN6.7 U2.D7(DQ6)
DDR_RES_D7: RN6.8 U2.E9(DQ7)
DDR_RES_D8: RN8.5 U2.E1(DQ8)
DDR_RES_D9: RN8.6 U2.D3(DQ9)
DDR_RES_D10: RN8.7 U2.D1(DQ10)
DDR_RES_D11: RN8.8 U2.C3(DQ11)
DDR_RES_D12: RN10.5 U2.C1(DQ12)
DDR_RES_D13: RN10.6 U2.B3(DQ13)
DDR_RES_D14: RN10.7 U2.B1(DQ14)
DDR_RES_D15: RN10.8 U2.A2(DQ15)
DDR_RES_~{DCAS}: RN7.6 U2.G8(~{CAS})
DDR_RES_~{DCLKE}: RN9.6 U2.H3(CKE)
DDR_RES_~{DCS0}: RN4.5 U2.H8(~{CS})
DDR_RES_~{DRAS}: RN7.8 U2.H7(~{RAS})
DDR_RES_~{DWR}: RN7.7 U2.G7(~{WE})
DDR_RES_DQM0: RN7.5 U2.F7(LDM)
DDR_RES_DQM1: RN9.8 U2.F3(UDM)
DDR_RES_DQS0: R3.2 U2.E7(LDQS)
DDR_RES_DQS1: R4.2 U2.E3(UDQS)
DDR_VREF: C1.1 C2.2 R1.1 R2.2 TP1.0 U2.F1(VREF) ; port DDR_VREF

Not connected (* = marked no-connect by the designer): RN9 2 4 5 7; U1 B19(~{DCS1})* C18(DCLK1)* D18(~{DCLK1})*; U2 F9(DNU)*

### Buses and harness runs
bus DDR_A[0..12]
bus DDR_D[0..15]
bus DDR_RES_A[0..12]
bus DDR_RES_D[0..15]

### Layout directives
net class DDR_ADDR: DDR_A0, DDR_A1, DDR_A2, DDR_A3, DDR_A4, DDR_A5, DDR_A6, DDR_A7, DDR_A8, DDR_A9, DDR_A10, DDR_A11, DDR_A12, DDR_RES_A0, DDR_RES_A1, DDR_RES_A2, DDR_RES_A3, DDR_RES_A4, DDR_RES_A5, DDR_RES_A6, DDR_RES_A7, DDR_RES_A8, DDR_RES_A9, DDR_RES_A10, DDR_RES_A11, DDR_RES_A12
net class DDR_DATA: DDR_D0, DDR_D1, DDR_D2, DDR_D3, DDR_D4, DDR_D5, DDR_D6, DDR_D7, DDR_D8, DDR_D9, DDR_D10, DDR_D11, DDR_D12, DDR_D13, DDR_D14, DDR_D15, DDR_RES_D0, DDR_RES_D1, DDR_RES_D2, DDR_RES_D3, DDR_RES_D4, DDR_RES_D5, DDR_RES_D6, DDR_RES_D7, DDR_RES_D8, DDR_RES_D9, DDR_RES_D10, DDR_RES_D11, DDR_RES_D12, DDR_RES_D13, DDR_RES_D14, DDR_RES_D15
differential pair; net class DIFF100: DDR_DCLK0_N, DDR_DCLK0_P
mark named DDR_CTRL: DDR_BA0, DDR_BA1, DDR_DQM0, DDR_DQM1, DDR_DQS0, DDR_DQS1, DDR_RES_DQM0, DDR_RES_DQM1, DDR_RES_DQS0, DDR_RES_DQS1, DDR_RES_~{DCAS}, DDR_RES_~{DCLKE}, DDR_RES_~{DCS0}, DDR_RES_~{DRAS}, DDR_RES_~{DWR}, DDR_~{DCAS}, DDR_~{DCLKE}, DDR_~{DCS0}, DDR_~{DRAS}, DDR_~{DWR}
mark named DDR_CLK: DDR_DCLK0_N, DDR_DCLK0_P

### Notes on the sheet
- DDR RAM
- CONFIDENTAL. Do not distribute.
- Variant:
- Checked by
- (in symbol CAY16-220J4LF) 22R
- (in symbol SDTitleBlock) Title:; Page Contents:; Revision:; Size:; DWG NO; Date:; Sheet; of

### Library data of the parts
C1 C2 = 0402ZD104KAT2A: Chip Capacitor, 0.1 uF, +/- 10%, 10 V, -55 to 85 degC, 0402 (1005 Metric), RoHS, Tape and Reel; Voltage Rating: 10 V; Capacitance: 100 nF; Case\Package: 0402; Type (Capacitors): X5R; Min Operating Temperature: -55 degC; Max Operating Temperature: 85 degC; ComponentLink2URL: http://datasheets.avx.com/cx5r.pdf; Packaging: Cut Tape; Tolerance: 10%; Pins: 2; Case Code (Imperial): 0402; PackageDescription: 2-Pin Surface Mount Device, Body 1 x 0.5 mm; ComponentLink1Description: Manufacturer URL; DatasheetVersion: 05/2016; Width: 0.5 mm; ComponentLink1URL: http://www.avx.com/; Length: 1 mm; Package Quantity: 1; PackageReference: 0402; Mount: Surface Mount; Radiation Hardening: No; REACH SVHC: No SVHC; Mounting Technology: Surface Mount; ComponentLink2Description: Datasheet; RoHSCompliant: true; Case Code (Metric): 1005; Height: 0.56 mm; Voltage Rating (DC): 10 V
R1 R2 = RT0402FRE071KL: 1 kOhms ±1% 0.063W, 1/16W Chip Resistor 0402 (1005 Metric)  Thin Film; Manufacturer: Yageo; Resistance: 1kR; Temperature Coefficient: 50ppm/°C; Power Rating: 62.5mW; Voltage Rating: 50V; Max Power Dissipation: 63mW; Part Number: RT0402FRE071KL; Supplier 1: Digi-Key; Manufacturer Part Number: RT0402FRE071KL; RoHS: Yes; Category: Chip SMD Resistors; Stock 1: 115371; Pricing 1: 1=0.10000, 10=0.07000, 100=0.02830, 1000=0.01272, 2500=0.01104, 5000=0.00912 (USD); Case/Package: 0402; Contact Plating: Tin,Matte,Lead; Case Code (Metric): 1005; Case Code (Imperial): 0402; Min Operating Temperature: -55°C; Max Operating Temperature: 125°C; Tolerance: 1%; Resistor Type: Thin Film; Package Quantity: 10000; Packaging: Tape and Reel; Number of Terminations: 2; Termination: SMD/SMT; Voltage Rating (DC): 50V; Features: Moisture Resistant; Length: 1mm; Width: 0.02inch; Height: 0.014inch; Depth: 0.5mm; Radiation Hardening: No; Military Standard: Not; Lead Free: Lead Free; ComponentLink1URL: https://datasheet.ciiva.com/12834/pyu-rt-1-to-0-05-rohs-l-4-12834181.pdf?src-supplier=Mouser; ComponentLink1Description: https://datasheet.ciiva.com/12834/pyu-rt-1-to-0-05-rohs-l-4-12834181.pdf?src-supplier=Mouser; ComponentLink2URL: https://datasheet.ciiva.com/25647/pyu-rt-1-to-0-05-rohs-l-4-25647306.pdf?src-supplier=Digi-Key; ComponentLink2Description: https://datasheet.ciiva.com/25647/pyu-rt-1-to-0-05-rohs-l-4-25647306.pdf?src-supplier=Digi-Key; ComponentLink3URL: https://datasheet.ciiva.com/8896/pyu-rt-1-to-0-05-rohs-l-4-8896188.pdf?src-supplier=Avnet; ComponentLink3Description: https://datasheet.ciiva.com/8896/pyu-rt-1-to-0-05-rohs-l-4-8896188.pdf?src-supplier=Avnet
R3 R4 = CRCW040233R0JNEE: as R9 on sheet [06] - BOOT CONTROL; Digi-Key Part Number: CRCW040233R0JNEE-ND; Manufacturer Product Number: CRCW040233R0JNEE; Supplier: Vishay Dale; Package / Case: 0402; Resistance: 33R
RN1-RN10 = CAY16-220J4LF: 22 Ohm ±5% 62.5mW Power Per Element Isolated Resistor Network/Array ±200ppm/°C 1206 (3216 Metric), Convex, Long Side Terminals; Manufacturer: Bourns Inc.; Manufacturer Product Number: CAY16-220J4LF; Power Per Element: 62.5mW; Tolerance: ±5%; Digi-Key Part Number: CAY16-220J4LFDKR-ND
TP1 = TP
U1 = ADSP-BF548BBCZ-5A: as U1 on sheet [06] - BOOT CONTROL; Manufacturer_Part_Number: ADSP-BF548BBCZ-5A; Supplier: Analog Devices Inc.; Manufacturer Product Number: ADSP-BF548BBCZ-5A; TypeDigi-Key Part Number: ADSP-BF548BBCZ-5A-ND
U2 = MT46V32M16CY-5B IT:J TR: SDRAM - DDR Memory IC 512Mb (32M x 16) Parallel 200MHz 700ps 60-FBGA (8x12.5); Manufacturer: Micron Technology Inc.; Manufacturer Product Number: MT46V32M16CY-5B IT:J; Digi-Key Part Number: MT46V32M16CY-5BIT:J-ND; Package / Case: 60-TFBGA; Supplier: Micron Technology Inc.; Series: -

## Sheet [05] - FLASH MEMORY INTERFACE.SchDoc
size A2; DocumentNumber: 2; SheetNumber: 5; SheetTotal: 10
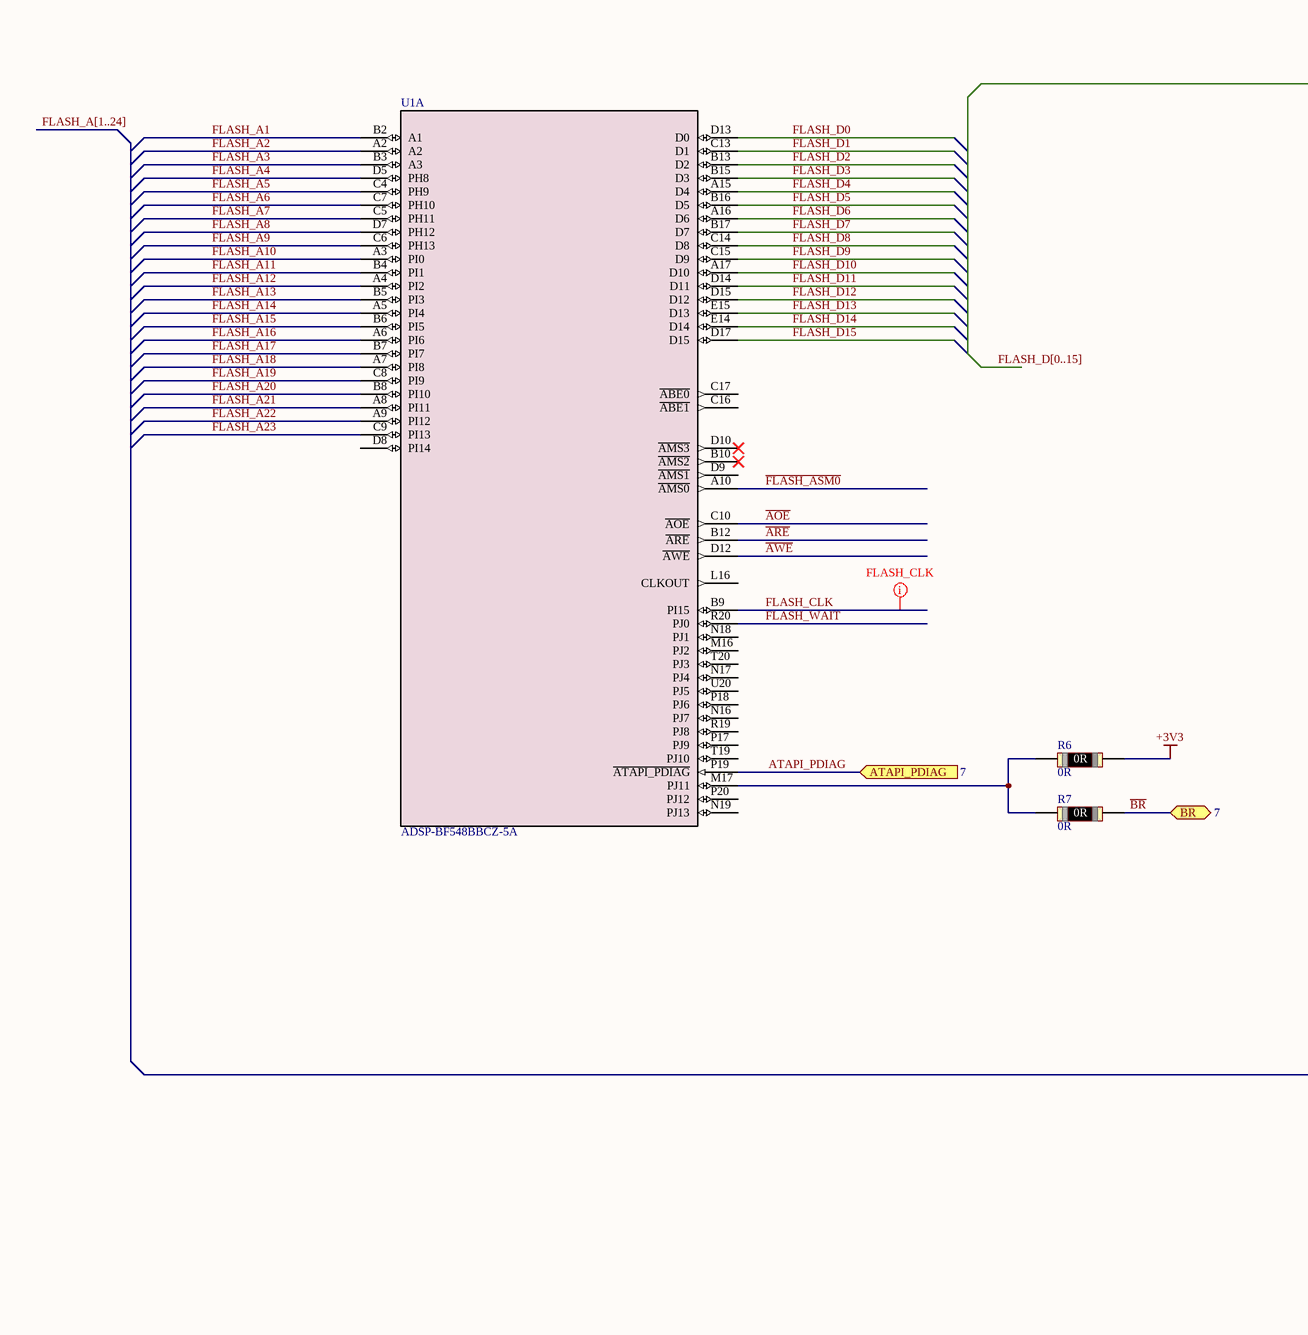
[diagram p10: [05] - FLASH MEMORY INTERFACE.SchDoc, left]
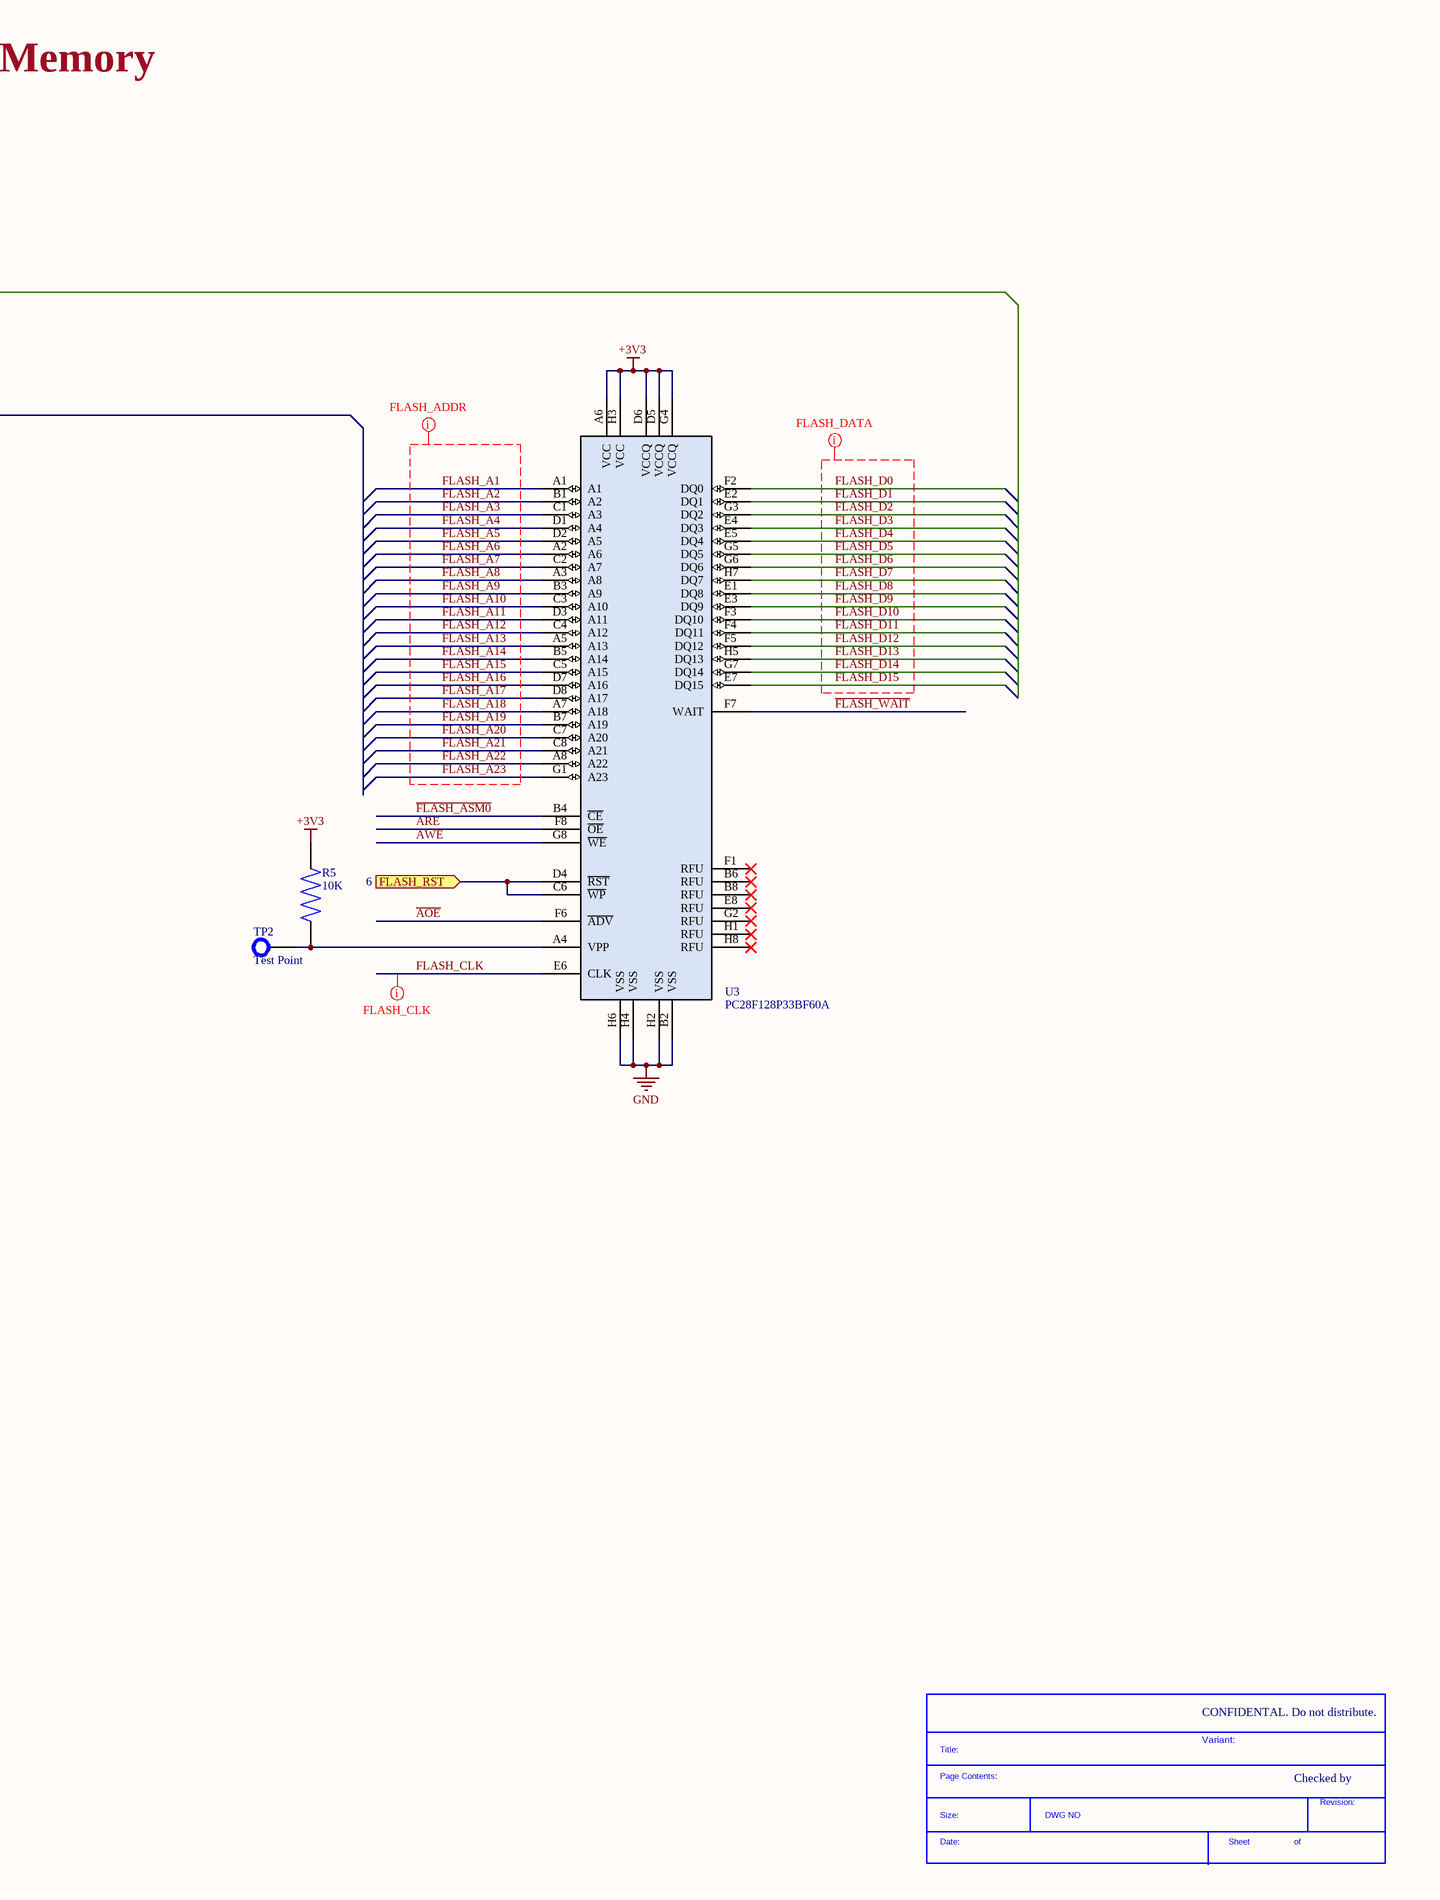
[diagram p11: [05] - FLASH MEMORY INTERFACE.SchDoc, right]

### Parts
(Parts that share a designator on the sheet are numbered #1, #2 ... from top to bottom, then left to right.)
*#7  SDTitleBlock  (value not drawn)  (graphical)
R5  10K  [RES0402]
R6  0R  [RES0402]
R7  0R  [RES0402]
TP2  Test Point  [TP_70MIL]
U1  ADSP-BF548BBCZ-5A  [BC_400_1_ADI]  (part A of 7)
U3  PC28F128P33BF60A  [BGA64_8X10_MRN]

### Ports
ATAPI_PDIAG (in, see 7), BR (bidir, see 7), FLASH_RST (in, see 6)

### Nets
+3V3: R5.2 R6.2 U3.A6(VCC) U3.D5(VCCQ) U3.D6(VCCQ) U3.G4(VCCQ) U3.H3(VCC)
GND: U3.B2(VSS) U3.H2(VSS) U3.H4(VSS) U3.H6(VSS)
~{AOE}: U1.C10(~{AOE}) U3.F6(~{ADV})
~{ARE}: U1.B12(~{ARE}) U3.F8(~{OE})
~{AWE}: U1.D12(~{AWE}) U3.G8(~{WE})
ATAPI_PDIAG: U1.P19(~{ATAPI_PDIAG}) ; port ATAPI_PDIAG
~{BR}: R7.2 ; port BR
~{FLASH_ASM0}: U1.A10(~{AMS0}) U3.B4(~{CE})
~{FLASH_WAIT}: U1.R20(PJ0) U3.F7(WAIT)
FLASH_A1: U1.B2(A1) U3.A1
FLASH_A2: U1.A2 U3.B1(A2)
FLASH_A3: U1.B3(A3) U3.C1(A3)
FLASH_A4: U1.D5(PH8) U3.D1(A4)
FLASH_A5: U1.C4(PH9) U3.D2(A5)
FLASH_A6: U1.C7(PH10) U3.A2(A6)
FLASH_A7: U1.C5(PH11) U3.C2(A7)
FLASH_A8: U1.D7(PH12) U3.A3(A8)
FLASH_A9: U1.C6(PH13) U3.B3(A9)
FLASH_A10: U1.A3(PI0) U3.C3(A10)
FLASH_A11: U1.B4(PI1) U3.D3(A11)
FLASH_A12: U1.A4(PI2) U3.C4(A12)
FLASH_A13: U1.B5(PI3) U3.A5(A13)
FLASH_A14: U1.A5(PI4) U3.B5(A14)
FLASH_A15: U1.B6(PI5) U3.C5(A15)
FLASH_A16: U1.A6(PI6) U3.D7(A16)
FLASH_A17: U1.B7(PI7) U3.D8(A17)
FLASH_A18: U1.A7(PI8) U3.A7(A18)
FLASH_A19: U1.C8(PI9) U3.B7(A19)
FLASH_A20: U1.B8(PI10) U3.C7(A20)
FLASH_A21: U1.A8(PI11) U3.C8(A21)
FLASH_A22: U1.A9(PI12) U3.A8(A22)
FLASH_A23: U1.C9(PI13) U3.G1(A23)
FLASH_CLK: U1.B9(PI15) U3.E6(CLK)
FLASH_D0: U1.D13(D0) U3.F2(DQ0)
FLASH_D1: U1.C13(D1) U3.E2(DQ1)
FLASH_D2: U1.B13(D2) U3.G3(DQ2)
FLASH_D3: U1.B15(D3) U3.E4(DQ3)
FLASH_D4: U1.A15(D4) U3.E5(DQ4)
FLASH_D5: U1.B16(D5) U3.G5(DQ5)
FLASH_D6: U1.A16(D6) U3.G6(DQ6)
FLASH_D7: U1.B17(D7) U3.H7(DQ7)
FLASH_D8: U1.C14(D8) U3.E1(DQ8)
FLASH_D9: U1.C15(D9) U3.E3(DQ9)
FLASH_D10: U1.A17(D10) U3.F3(DQ10)
FLASH_D11: U1.D14(D11) U3.F4(DQ11)
FLASH_D12: U1.D15(D12) U3.F5(DQ12)
FLASH_D13: U1.E15(D13) U3.H5(DQ13)
FLASH_D14: U1.E14(D14) U3.G7(DQ14)
FLASH_D15: U1.D17(D15) U3.E7(DQ15)
RESET: U3.C6(~{WP}) U3.D4(~{RST}) ; port FLASH_RST
NetR5_1: R5.1 TP2.0 U3.A4(VPP)
NetR6_1: R6.1 R7.1 U1.M17(PJ11)

Not connected (* = marked no-connect by the designer): U1 B10(~{AMS2})* C16(~{ABE1}) C17(~{ABE0}) D8(PI14) D9(~{AMS1}) D10(~{AMS3})* L16(CLKOUT) M16(PJ2) N16(PJ7) N17(PJ4) N18(PJ1) N19(PJ13) P17(PJ9) P18(PJ6) P20(PJ12) R19(PJ8) T19(PJ10) T20(PJ3) U20(PJ5); U3 B6(RFU)* B8(RFU)* E8(RFU)* F1(RFU)* G2(RFU)* H1(RFU)* H8(RFU)*

### Buses and harness runs
bus FLASH_A[1..24]
bus FLASH_D[0..15]

### Layout directives
net class FLASH_ADDR: FLASH_A1, FLASH_A2, FLASH_A3, FLASH_A4, FLASH_A5, FLASH_A6, FLASH_A7, FLASH_A8, FLASH_A9, FLASH_A10, FLASH_A11, FLASH_A12, FLASH_A13, FLASH_A14, FLASH_A15, FLASH_A16, FLASH_A17, FLASH_A18, FLASH_A19, FLASH_A20, FLASH_A21, FLASH_A22, FLASH_A23
net class FLASH_DATA: FLASH_D0, FLASH_D1, FLASH_D2, FLASH_D3, FLASH_D4, FLASH_D5, FLASH_D6, FLASH_D7, FLASH_D8, FLASH_D9, FLASH_D10, FLASH_D11, FLASH_D12, FLASH_D13, FLASH_D14, FLASH_D15
net class FLASH_CLK: FLASH_CLK
mark named FLASH_CLK: FLASH_CLK

### Notes on the sheet
- Flash Memory
- CLOCKS (CPU & PCIE)
- CONFIDENTAL. Do not distribute.
- Variant:
- Checked by
- (in symbol SDTitleBlock) Title:; Page Contents:; Revision:; Size:; DWG NO; Date:; Sheet; of

### Library data of the parts
R5 = CRCW040210K0FHEDP: 10 kOhms ±1% 0.063W, 1/16W Chip Resistor 0402 (1005 Metric) Automotive AEC-Q200 Thick Film; Manufacturer: Vishay Dale; Digi-Key Part Number: CRCW040210K0FHEDP-ND; Manufacturer Product Number: CRCW040210K0FHEDP; Supplier: Vishay Dale; Package / Case: 0402; Resistance: 10K
R6 R7 = RC0402FR-070RL: 0 Ohms Jumper 0.063W, 1/16W Chip Resistor 0402 (1005 Metric)  Thick Film; Manufacturer: Yageo; Digi-Key Part Number: 311-0.0LRTR-ND; Manufacturer Product Number: RC0402FR-070RL; Supplier: Yageo; Package / Case: 0402; Resistance: 0R
TP2 = TP
U1 = ADSP-BF548BBCZ-5A: as U1 on sheet [06] - BOOT CONTROL; Manufacturer_Part_Number: ADSP-BF548BBCZ-5A; Supplier: Analog Devices Inc.; Manufacturer Product Number: ADSP-BF548BBCZ-5A; TypeDigi-Key Part Number: ADSP-BF548BBCZ-5A-ND
U3 = PC28F128P33BF60A: FLASH - NOR Memory IC 128Mb (8M x 16) Parallel 52MHz 60ns 64-EasyBGA (10x13); Manufacturer: Alliance Memory, Inc.; Digi-Key Part Number: D:\embedded_systems\Projects\Pievision\BLACKFIN-SOM\Design; Manufacturer Product Number: PC28F128P33BF60A; Supplier: Alliance Memory, Inc.; Series: StrataFlash; Package / Case: 64-TBGA

## Sheet [07] - EXPANSION INTERFACE AND JTAG.SchDoc
size A2; DocumentNumber: 2; SheetNumber: 7; SheetTotal: 10
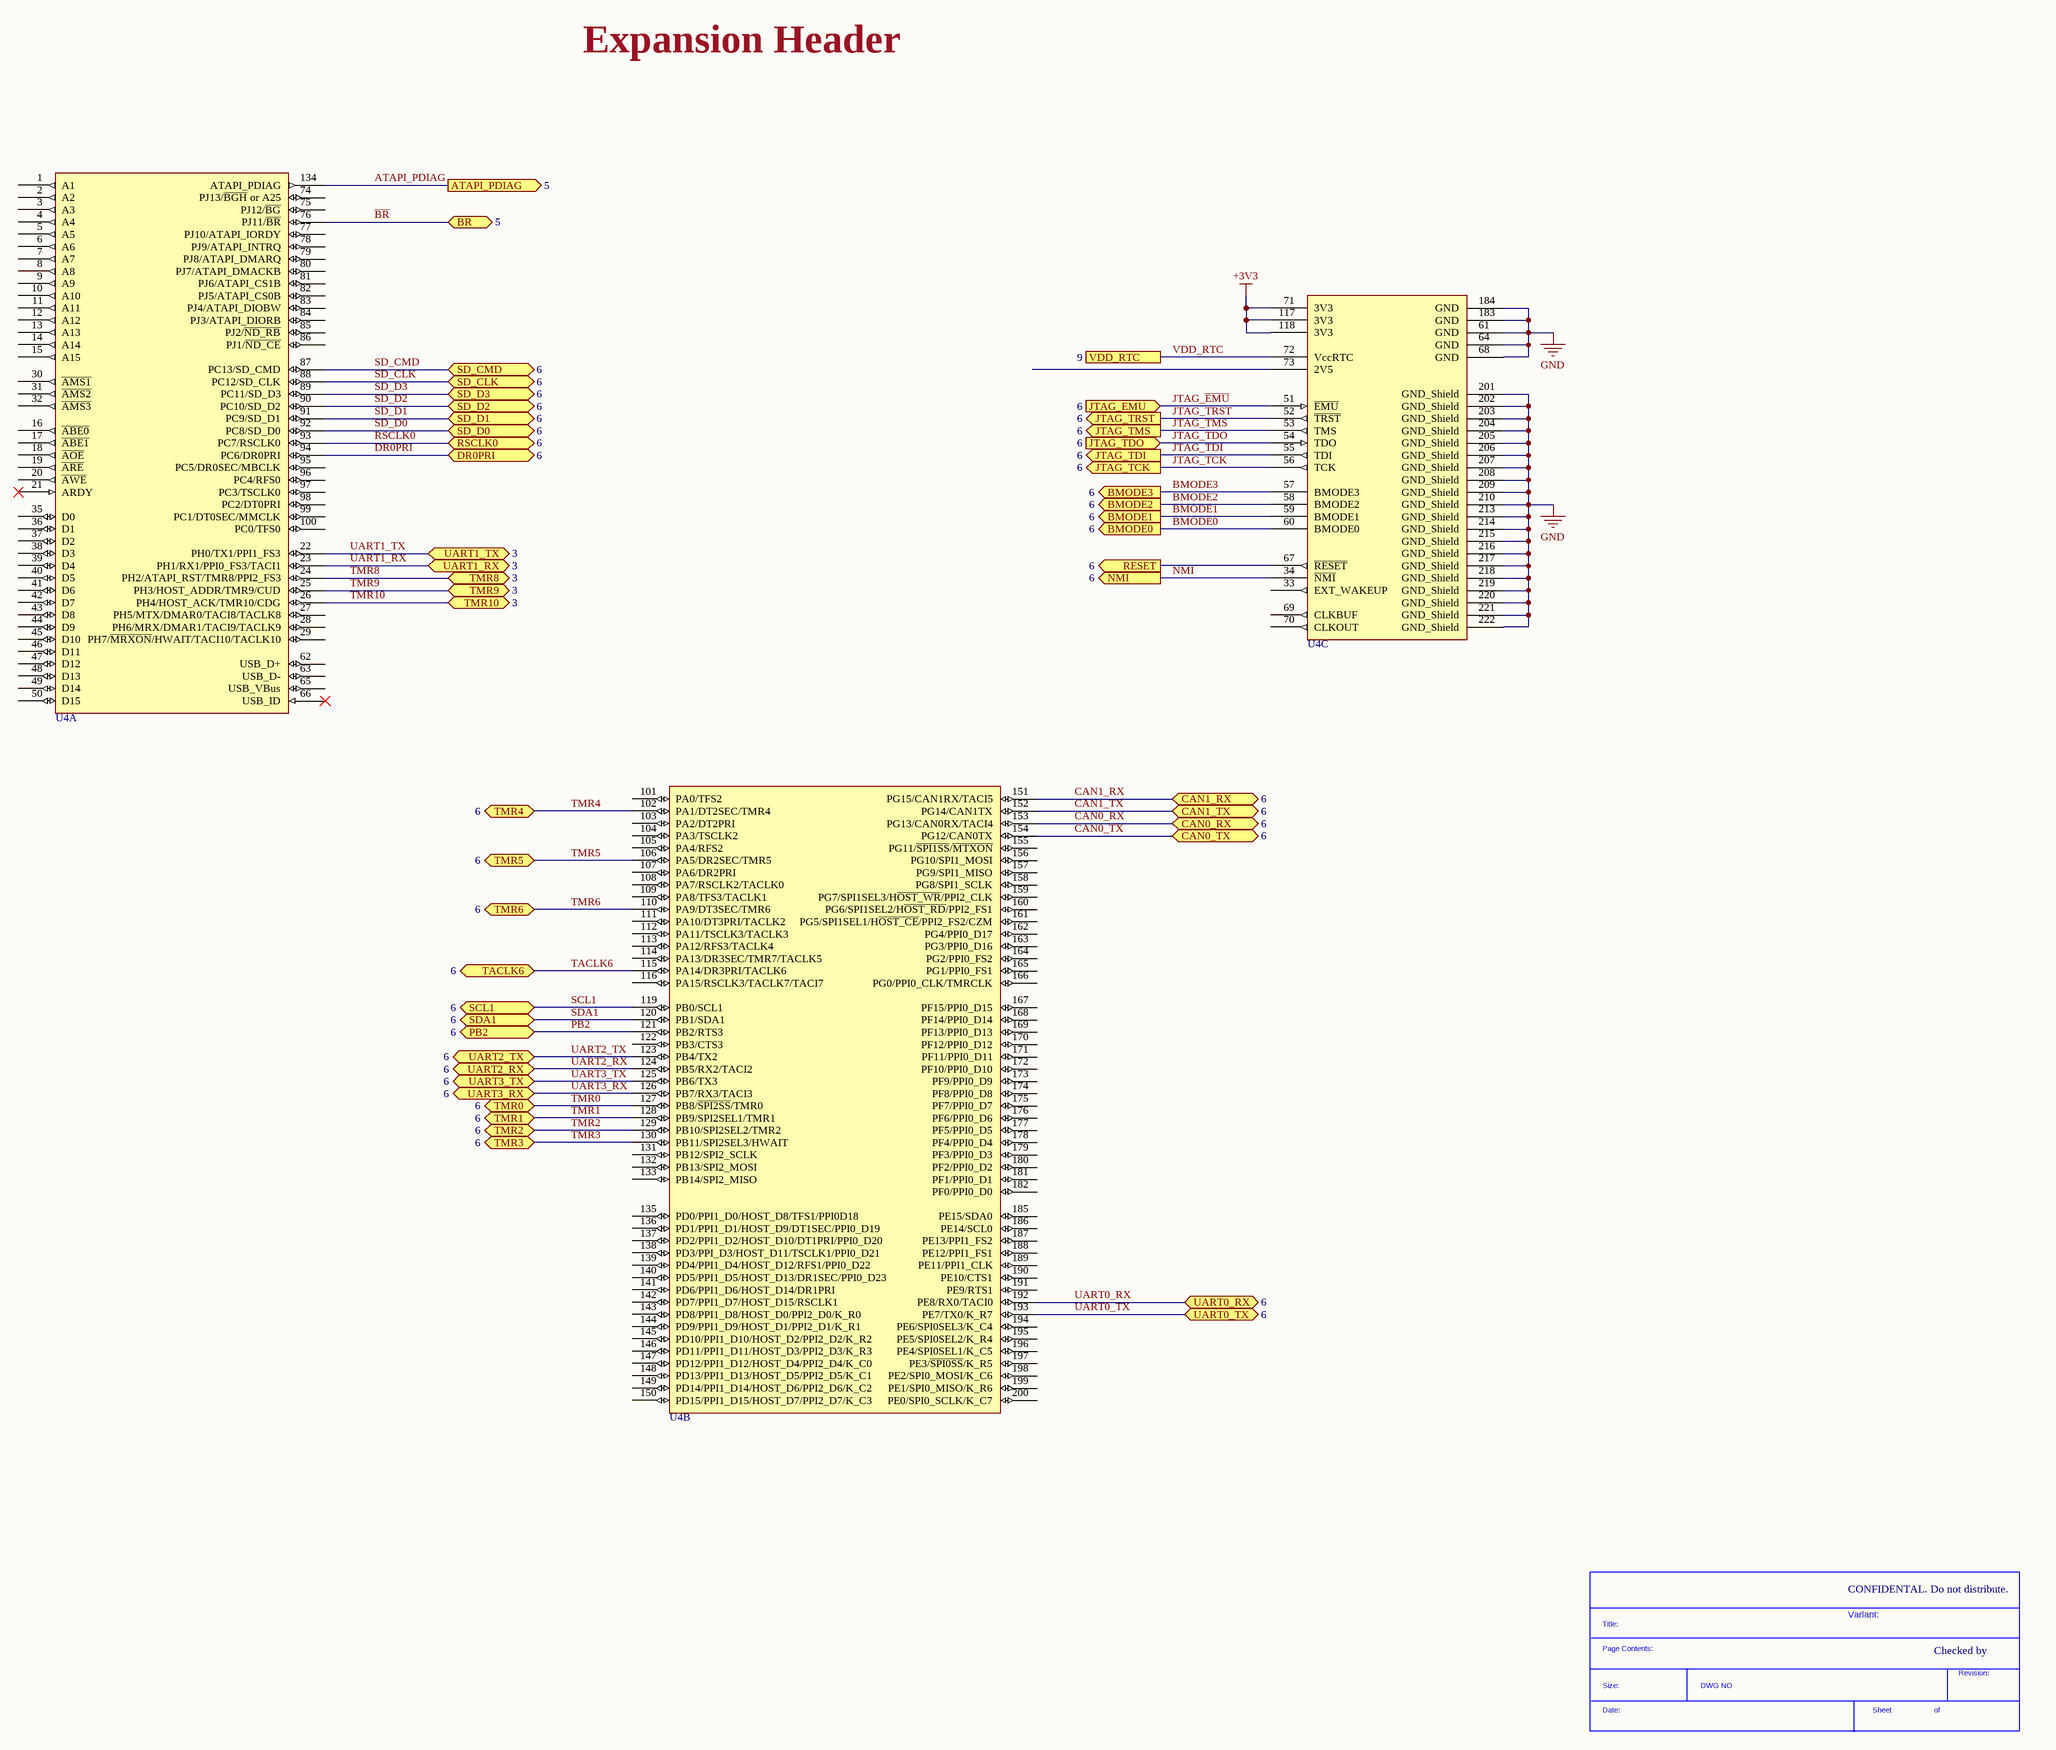
[diagram p12: [07] - EXPANSION INTERFACE AND JTAG.SchDoc]

### Parts
(Parts that share a designator on the sheet are numbered #1, #2 ... from top to bottom, then left to right.)
*#8  SDTitleBlock  (value not drawn)  (graphical)
U4  CM-BF548  [CM-BF548-ORIGIN]  (value not drawn)  (parts A,B,C of 3)

### Ports
ATAPI_PDIAG (out, see 5), BMODE0 (out, see 6), BMODE1 (out, see 6), BMODE2 (out, see 6), BMODE3 (out, see 6), BR (bidir, see 5), CAN0_RX (bidir, see 6), CAN0_TX (bidir, see 6), CAN1_RX (bidir, see 6), CAN1_TX (bidir, see 6), DR0PRI (bidir, see 6), JTAG_EMU (in, see 6), JTAG_TCK (out, see 6), JTAG_TDI (out, see 6), JTAG_TDO (in, see 6), JTAG_TMS (out, see 6), JTAG_TRST (out, see 6), NMI (out, see 6), PB2 (bidir, see 6), RESET (out, see 6), RSCLK0 (bidir, see 6), SCL1 (bidir, see 6), SD_CLK (bidir, see 6), SD_CMD (bidir, see 6), SD_D0 (bidir, see 6), SD_D1 (bidir, see 6), SD_D2 (bidir, see 6), SD_D3 (bidir, see 6), SDA1 (bidir, see 6), TACLK6 (bidir, see 6), TMR0 (bidir, see 6), TMR1 (bidir, see 6), TMR2 (bidir, see 6), TMR3 (bidir, see 6), TMR4 (bidir, see 6), TMR5 (bidir, see 6), TMR6 (bidir, see 6), TMR8 (bidir, see 3), TMR9 (bidir, see 3), TMR10 (bidir, see 3), UART0_RX (bidir, see 6), UART0_TX (bidir, see 6), UART1_RX (bidir, see 3), UART1_TX (bidir, see 3), UART2_RX (bidir, see 6), UART2_TX (bidir, see 6), UART3_RX (bidir, see 6), UART3_TX (bidir, see 6), VDD_RTC (see 9)

### Nets
+3V3: U4.71(3V3) U4.117(3V3) U4.118(3V3)
GND: U4.61(GND) U4.64(GND) U4.68(GND) U4.183(GND) U4.184(GND) U4.201(GND_Shield) U4.202(GND_Shield) U4.203(GND_Shield) U4.204(GND_Shield) U4.205(GND_Shield) U4.206(GND_Shield) U4.207(GND_Shield) U4.208(GND_Shield) U4.209(GND_Shield) U4.210(GND_Shield) U4.213(GND_Shield) U4.214(GND_Shield) U4.215(GND_Shield) U4.216(GND_Shield) U4.217(GND_Shield) U4.218(GND_Shield) U4.219(GND_Shield) U4.220(GND_Shield) U4.221(GND_Shield) U4.222(GND_Shield)
ATAPI_PDIAG: U4.134(ATAPI_PDIAG) ; port ATAPI_PDIAG
~{BR}: U4.76(PJ11/~{BR}) ; port BR
BMODE0: U4.60(BMODE0) ; port BMODE0
BMODE1: U4.59(BMODE1) ; port BMODE1
BMODE2: U4.58(BMODE2) ; port BMODE2
BMODE3: U4.57(BMODE3) ; port BMODE3
CAN0_RX: U4.153(PG13/CAN0RX/TACI4) ; port CAN0_RX
CAN0_TX: U4.154(PG12/CAN0TX) ; port CAN0_TX
CAN1_RX: U4.151(PG15/CAN1RX/TACI5) ; port CAN1_RX
CAN1_TX: U4.152(PG14/CAN1TX) ; port CAN1_TX
DR0PRI: U4.94(PC6/DR0PRI) ; port DR0PRI
JTAG_~{EMU}: U4.51(~{EMU}) ; port JTAG_EMU
JTAG_~{TRST}: U4.52(~{TRST}) ; port JTAG_TRST
JTAG_TCK: U4.56(TCK) ; port JTAG_TCK
JTAG_TDI: U4.55(TDI) ; port JTAG_TDI
JTAG_TDO: U4.54(TDO) ; port JTAG_TDO
JTAG_TMS: U4.53(TMS) ; port JTAG_TMS
~{NMI}: U4.34(~{NMI}) ; port NMI
PB2: U4.121(PB2/RTS3) ; port PB2
RESET: U4.67(~{RESET}) ; port RESET
RSCLK0: U4.93(PC7/RSCLK0) ; port RSCLK0
SCL1: U4.119(PB0/SCL1) ; port SCL1
SD_CLK: U4.88(PC12/SD_CLK) ; port SD_CLK
SD_CMD: U4.87(PC13/SD_CMD) ; port SD_CMD
SD_D0: U4.92(PC8/SD_D0) ; port SD_D0
SD_D1: U4.91(PC9/SD_D1) ; port SD_D1
SD_D2: U4.90(PC10/SD_D2) ; port SD_D2
SD_D3: U4.89(PC11/SD_D3) ; port SD_D3
SDA1: U4.120(PB1/SDA1) ; port SDA1
TACLK6: U4.115(PA14/DR3PRI/TACLK6) ; port TACLK6
TMR0: U4.127(PB8/~{SPI2SS}/TMR0) ; port TMR0
TMR1: U4.128(PB9/SPI2SEL1/TMR1) ; port TMR1
TMR2: U4.129(PB10/SPI2SEL2/TMR2) ; port TMR2
TMR3: U4.130(PB11/SPI2SEL3/HWAIT) ; port TMR3
TMR4: U4.102(PA1/DT2SEC/TMR4) ; port TMR4
TMR5: U4.106(PA5/DR2SEC/TMR5) ; port TMR5
TMR6: U4.110(PA9/DT3SEC/TMR6) ; port TMR6
TMR8: U4.24(PH2/ATAPI_RST/TMR8/PPI2_FS3) ; port TMR8
TMR9: U4.25(PH3/HOST_ADDR/TMR9/CUD) ; port TMR9
TMR10: U4.26(PH4/HOST_ACK/TMR10/CDG) ; port TMR10
UART0_RX: U4.192(PE8/RX0/TACI0) ; port UART0_RX
UART0_TX: U4.193(PE7/TX0/K_R7) ; port UART0_TX
UART1_RX: U4.23(PH1/RX1/PPI0_FS3/TACI1) ; port UART1_RX
UART1_TX: U4.22(PH0/TX1/PPI1_FS3) ; port UART1_TX
UART2_RX: U4.124(PB5/RX2/TACI2) ; port UART2_RX
UART2_TX: U4.123(PB4/TX2) ; port UART2_TX
UART3_RX: U4.126(PB7/RX3/TACI3) ; port UART3_RX
UART3_TX: U4.125(PB6/TX3) ; port UART3_TX
VDD_RTC: U4.72(VccRTC) ; port VDD_RTC

Not connected (* = marked no-connect by the designer): U4 1(A1) 2(A2) 3(A3) 4(A4) 5(A5) 6(A6) 7(A7) 8(A8) 9(A9) 10(A10) 11(A11) 12(A12) 13(A13) 14(A14) 15(A15) 16(~{ABE0}) 17(~{ABE1}) 18(~{AOE}) 19(~{ARE}) 20(~{AWE}) 21(ARDY)* 27(PH5/MTX/DMAR0/TACI8/TACLK8) 28(PH6/MRX/DMAR1/TACI9/TACLK9) 29(PH7/~{MRXON}/HWAIT/TACI10/TACLK10) 30(~{AMS1}) 31(~{AMS2}) 32(~{AMS3}) 33(EXT_WAKEUP) 35(D0) 36(D1) 37(D2) 38(D3) 39(D4) 40(D5) 41(D6) 42(D7) 43(D8) 44(D9) 45(D10) 46(D11) 47(D12) 48(D13) 49(D14) 50(D15) 62(USB_D+) 63(USB_D-) 65(USB_VBus) 66(USB_ID)* 69(CLKBUF) 70(CLKOUT) 73(2V5) 74(PJ13/~{BGH}_or_A25) 75(PJ12/~{BG}) 77(PJ10/ATAPI_IORDY) 78(PJ9/ATAPI_INTRQ) 79(PJ8/ATAPI_DMARQ) 80(PJ7/ATAPI_DMACKB) 81(PJ6/ATAPI_CS1B) 82(PJ5/ATAPI_CS0B) 83(PJ4/ATAPI_DIOBW) 84(PJ3/ATAPI_DIORB) 85(PJ2/~{ND_RB}) 86(PJ1/~{ND_CE}) 95(PC5/DR0SEC/MBCLK) 96(PC4/RFS0) 97(PC3/TSCLK0) 98(PC2/DT0PRI) 99(PC1/DT0SEC/MMCLK) 100(PC0/TFS0) 101(PA0/TFS2) 103(PA2/DT2PRI) 104(PA3/TSCLK2) 105(PA4/RFS2) 107(PA6/DR2PRI) 108(PA7/RSCLK2/TACLK0) 109(PA8/TFS3/TACLK1) 111(PA10/DT3PRI/TACLK2) 112(PA11/TSCLK3/TACLK3) 113(PA12/RFS3/TACLK4) 114(PA13/DR3SEC/TMR7/TACLK5) 116(PA15/RSCLK3/TACLK7/TACI7) 122(PB3/CTS3) 131(PB12/SPI2_SCLK) 132(PB13/SPI2_MOSI) 133(PB14/SPI2_MISO) 135(PD0/PPI1_D0/HOST_D8/TFS1/PPI0D18) 136(PD1/PPI1_D1/HOST_D9/DT1SEC/PPI0_D19) 137(PD2/PPI1_D2/HOST_D10/DT1PRI/PPI0_D20) 138(PD3/PPI_D3/HOST_D11/TSCLK1/PPI0_D21) 139(PD4/PPI1_D4/HOST_D12/RFS1/PPI0_D22) 140(PD5/PPI1_D5/HOST_D13/DR1SEC/PPI0_D23) 141(PD6/PPI1_D6/HOST_D14/DR1PRI) 142(PD7/PPI1_D7/HOST_D15/RSCLK1) 143(PD8/PPI1_D8/HOST_D0/PPI2_D0/K_R0) 144(PD9/PPI1_D9/HOST_D1/PPI2_D1/K_R1) 145(PD10/PPI1_D10/HOST_D2/PPI2_D2/K_R2) 146(PD11/PPI1_D11/HOST_D3/PPI2_D3/K_R3) 147(PD12/PPI1_D12/HOST_D4/PPI2_D4/K_C0) 148(PD13/PPI1_D13/HOST_D5/PPI2_D5/K_C1) 149(PD14/PPI1_D14/HOST_D6/PPI2_D6/K_C2) 150(PD15/PPI1_D15/HOST_D7/PPI2_D7/K_C3) 155(PG11/~{SPI1SS}/~{MTXON}) 156(PG10/SPI1_MOSI) 157(PG9/SPI1_MISO) 158(PG8/SPI1_SCLK) 159(PG7/SPI1SEL3/H~{OST_WR}/PPI2_CLK) 160(PG6/SPI1SEL2/H~{OST_RD}/PPI2_FS1) 161(PG5/SPI1SEL1/H~{OST_CE}/PPI2_FS2/CZM) 162(PG4/PPI0_D17) 163(PG3/PPI0_D16) 164(PG2/PPI0_FS2) 165(PG1/PPI0_FS1) 166(PG0/PPI0_CLK/TMRCLK) 167(PF15/PPI0_D15) 168(PF14/PPI0_D14) 169(PF13/PPI0_D13) 170(PF12/PPI0_D12) 171(PF11/PPI0_D11) 172(PF10/PPI0_D10) 173(PF9/PPI0_D9) 174(PF8/PPI0_D8) 175(PF7/PPI0_D7) 176(PF6/PPI0_D6) 177(PF5/PPI0_D5) 178(PF4/PPI0_D4) 179(PF3/PPI0_D3) 180(PF2/PPI0_D2) 181(PF1/PPI0_D1) 182(PF0/PPI0_D0) 185(PE15/SDA0) 186(PE14/SCL0) 187(PE13/PPI1_FS2) 188(PE12/PPI1_FS1) 189(PE11/PPI1_CLK) 190(PE10/CTS1) 191(PE9/RTS1) 194(PE6/SPI0SEL3/K_C4) 195(PE5/SPI0SEL2/K_R4) 196(PE4/SPI0SEL1/K_C5) 197(PE3/~{SPI0SS}/K_R5) 198(PE2/SPI0_MOSI/K_C6) 199(PE1/SPI0_MISO/K_R6) 200(PE0/SPI0_SCLK/K_C7)

### Notes on the sheet
- Expansion Header
- CLOCKS (CPU & PCIE)
- CONFIDENTAL. Do not distribute.
- Variant:
- Checked by
- (in symbol SDTitleBlock) Title:; Page Contents:; Revision:; Size:; DWG NO; Date:; Sheet; of

## Sheet [08] - PUSH BUTTONS LEDS AND RESET.SchDoc
size A2; DocumentNumber: 2; SheetNumber: 8; SheetTotal: 10
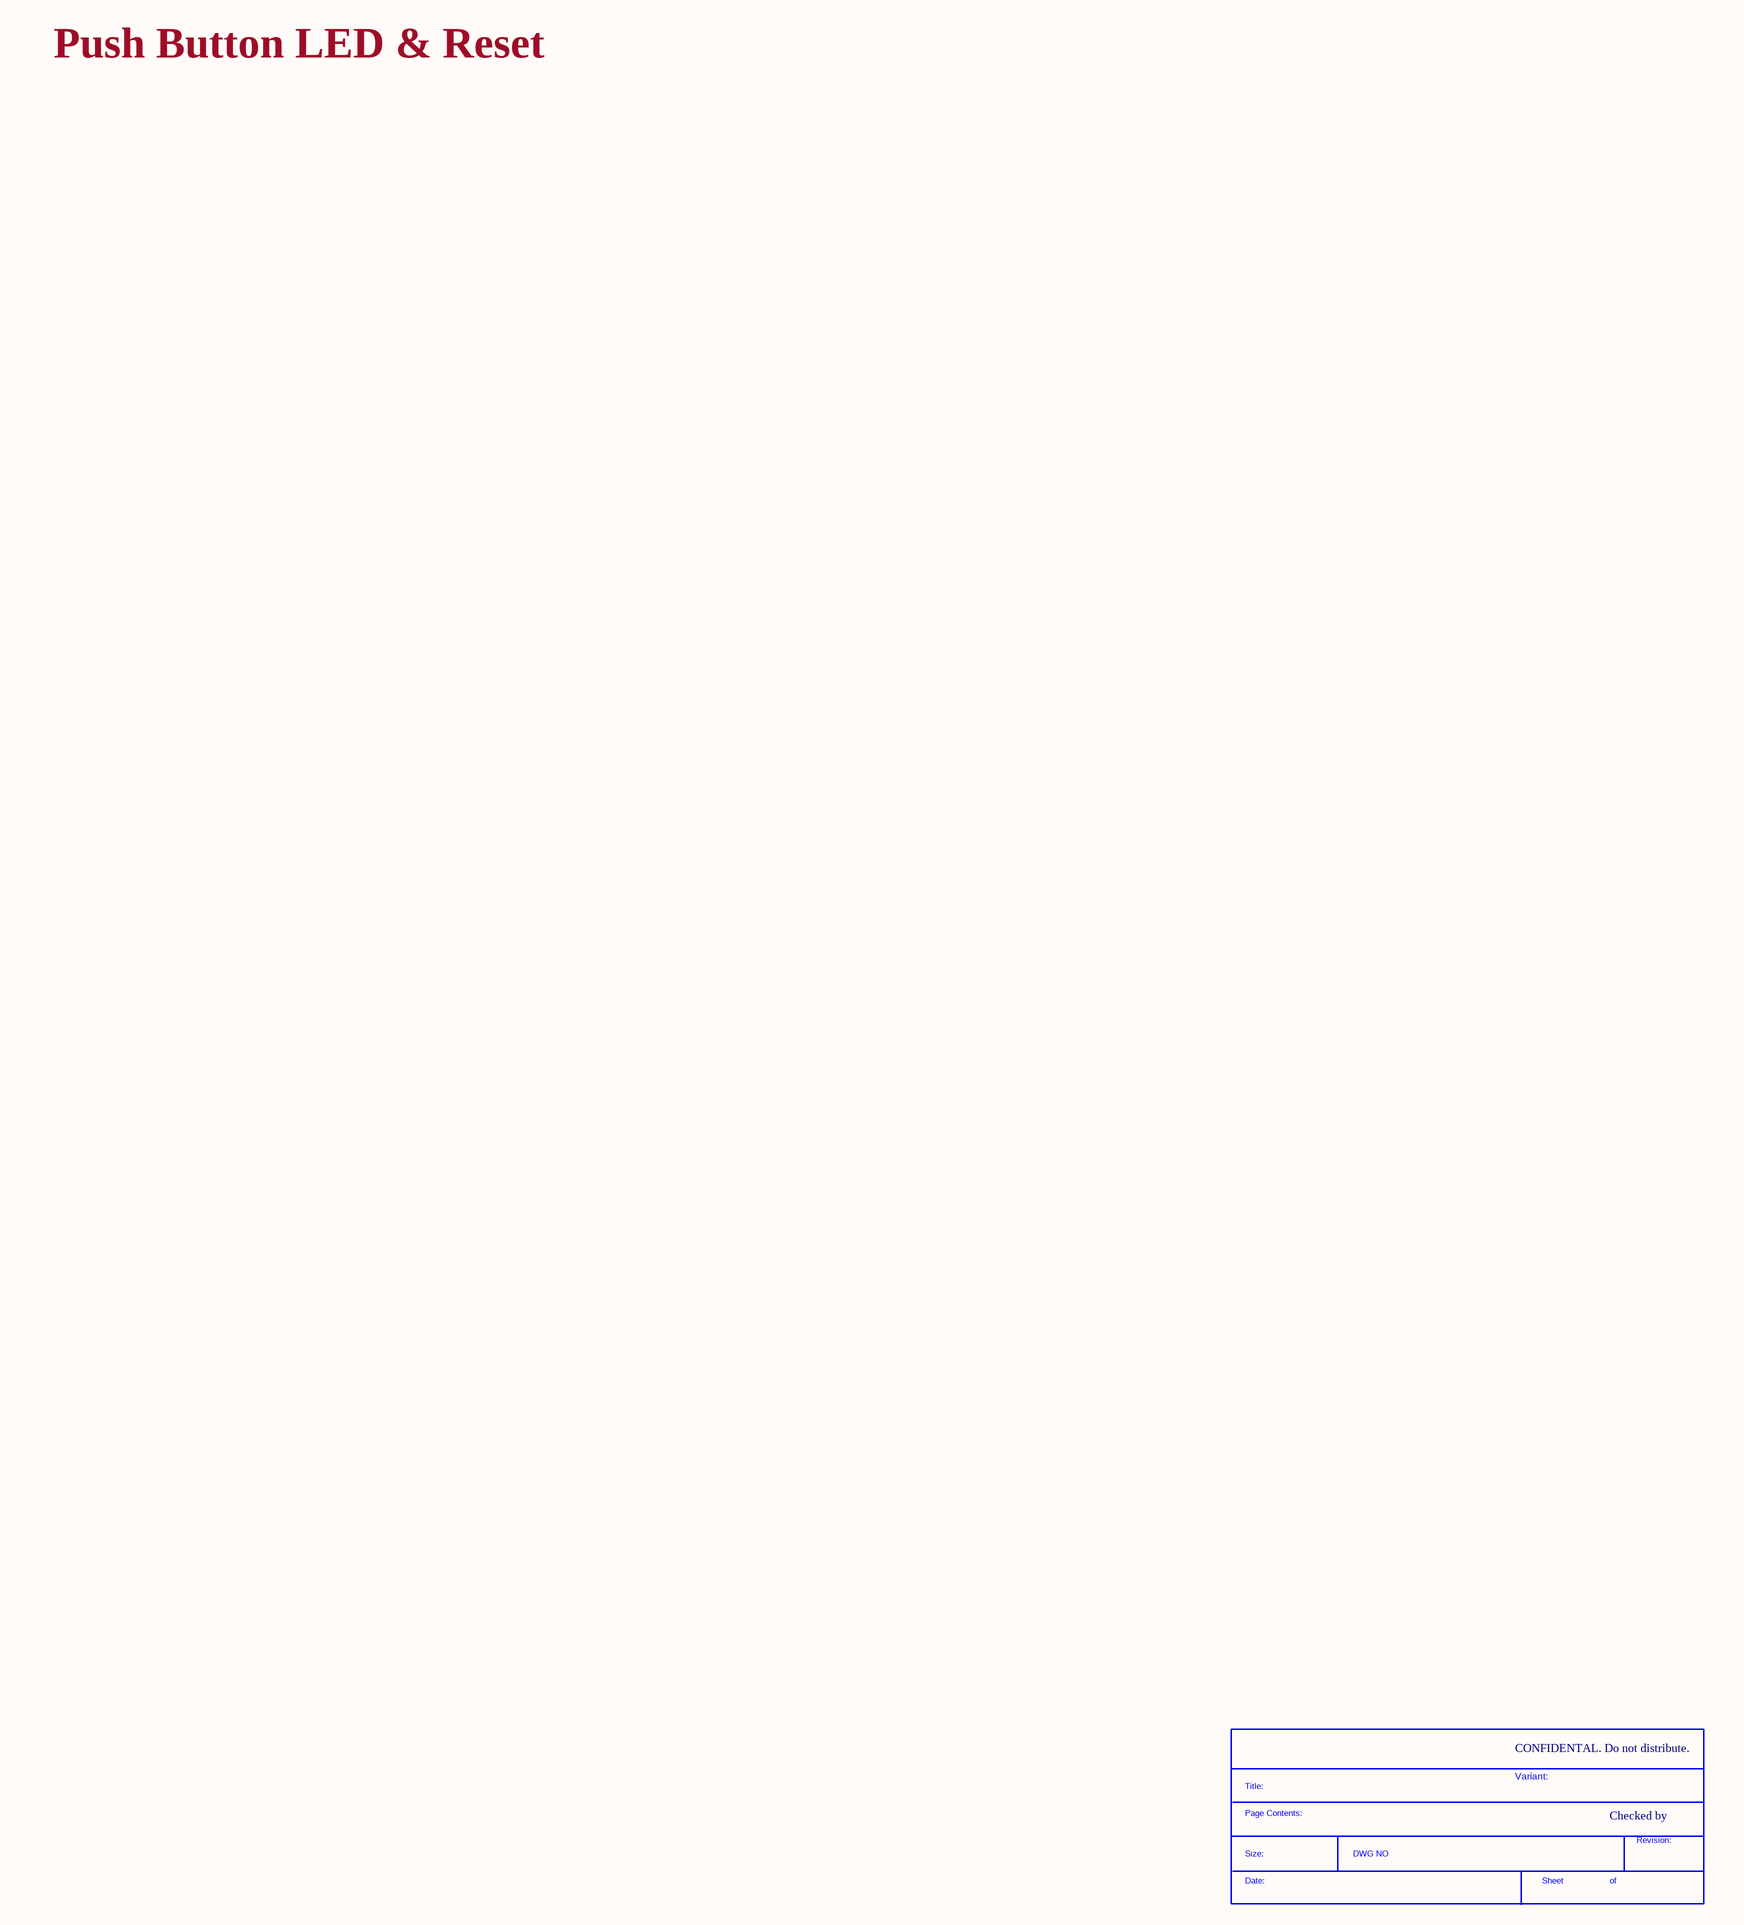
[diagram p13: [08] - PUSH BUTTONS LEDS AND RESET.SchDoc]

### Parts
(Parts that share a designator on the sheet are numbered #1, #2 ... from top to bottom, then left to right.)
*#9  SDTitleBlock  (value not drawn)  (graphical)

### Notes on the sheet
- Push Button LED & Reset
- CONFIDENTAL. Do not distribute.
- Variant:
- Checked by
- (in symbol SDTitleBlock) Title:; Page Contents:; Revision:; Size:; DWG NO; Date:; Sheet; of